# Altium project Water Tank Telemeter.PrjPcb
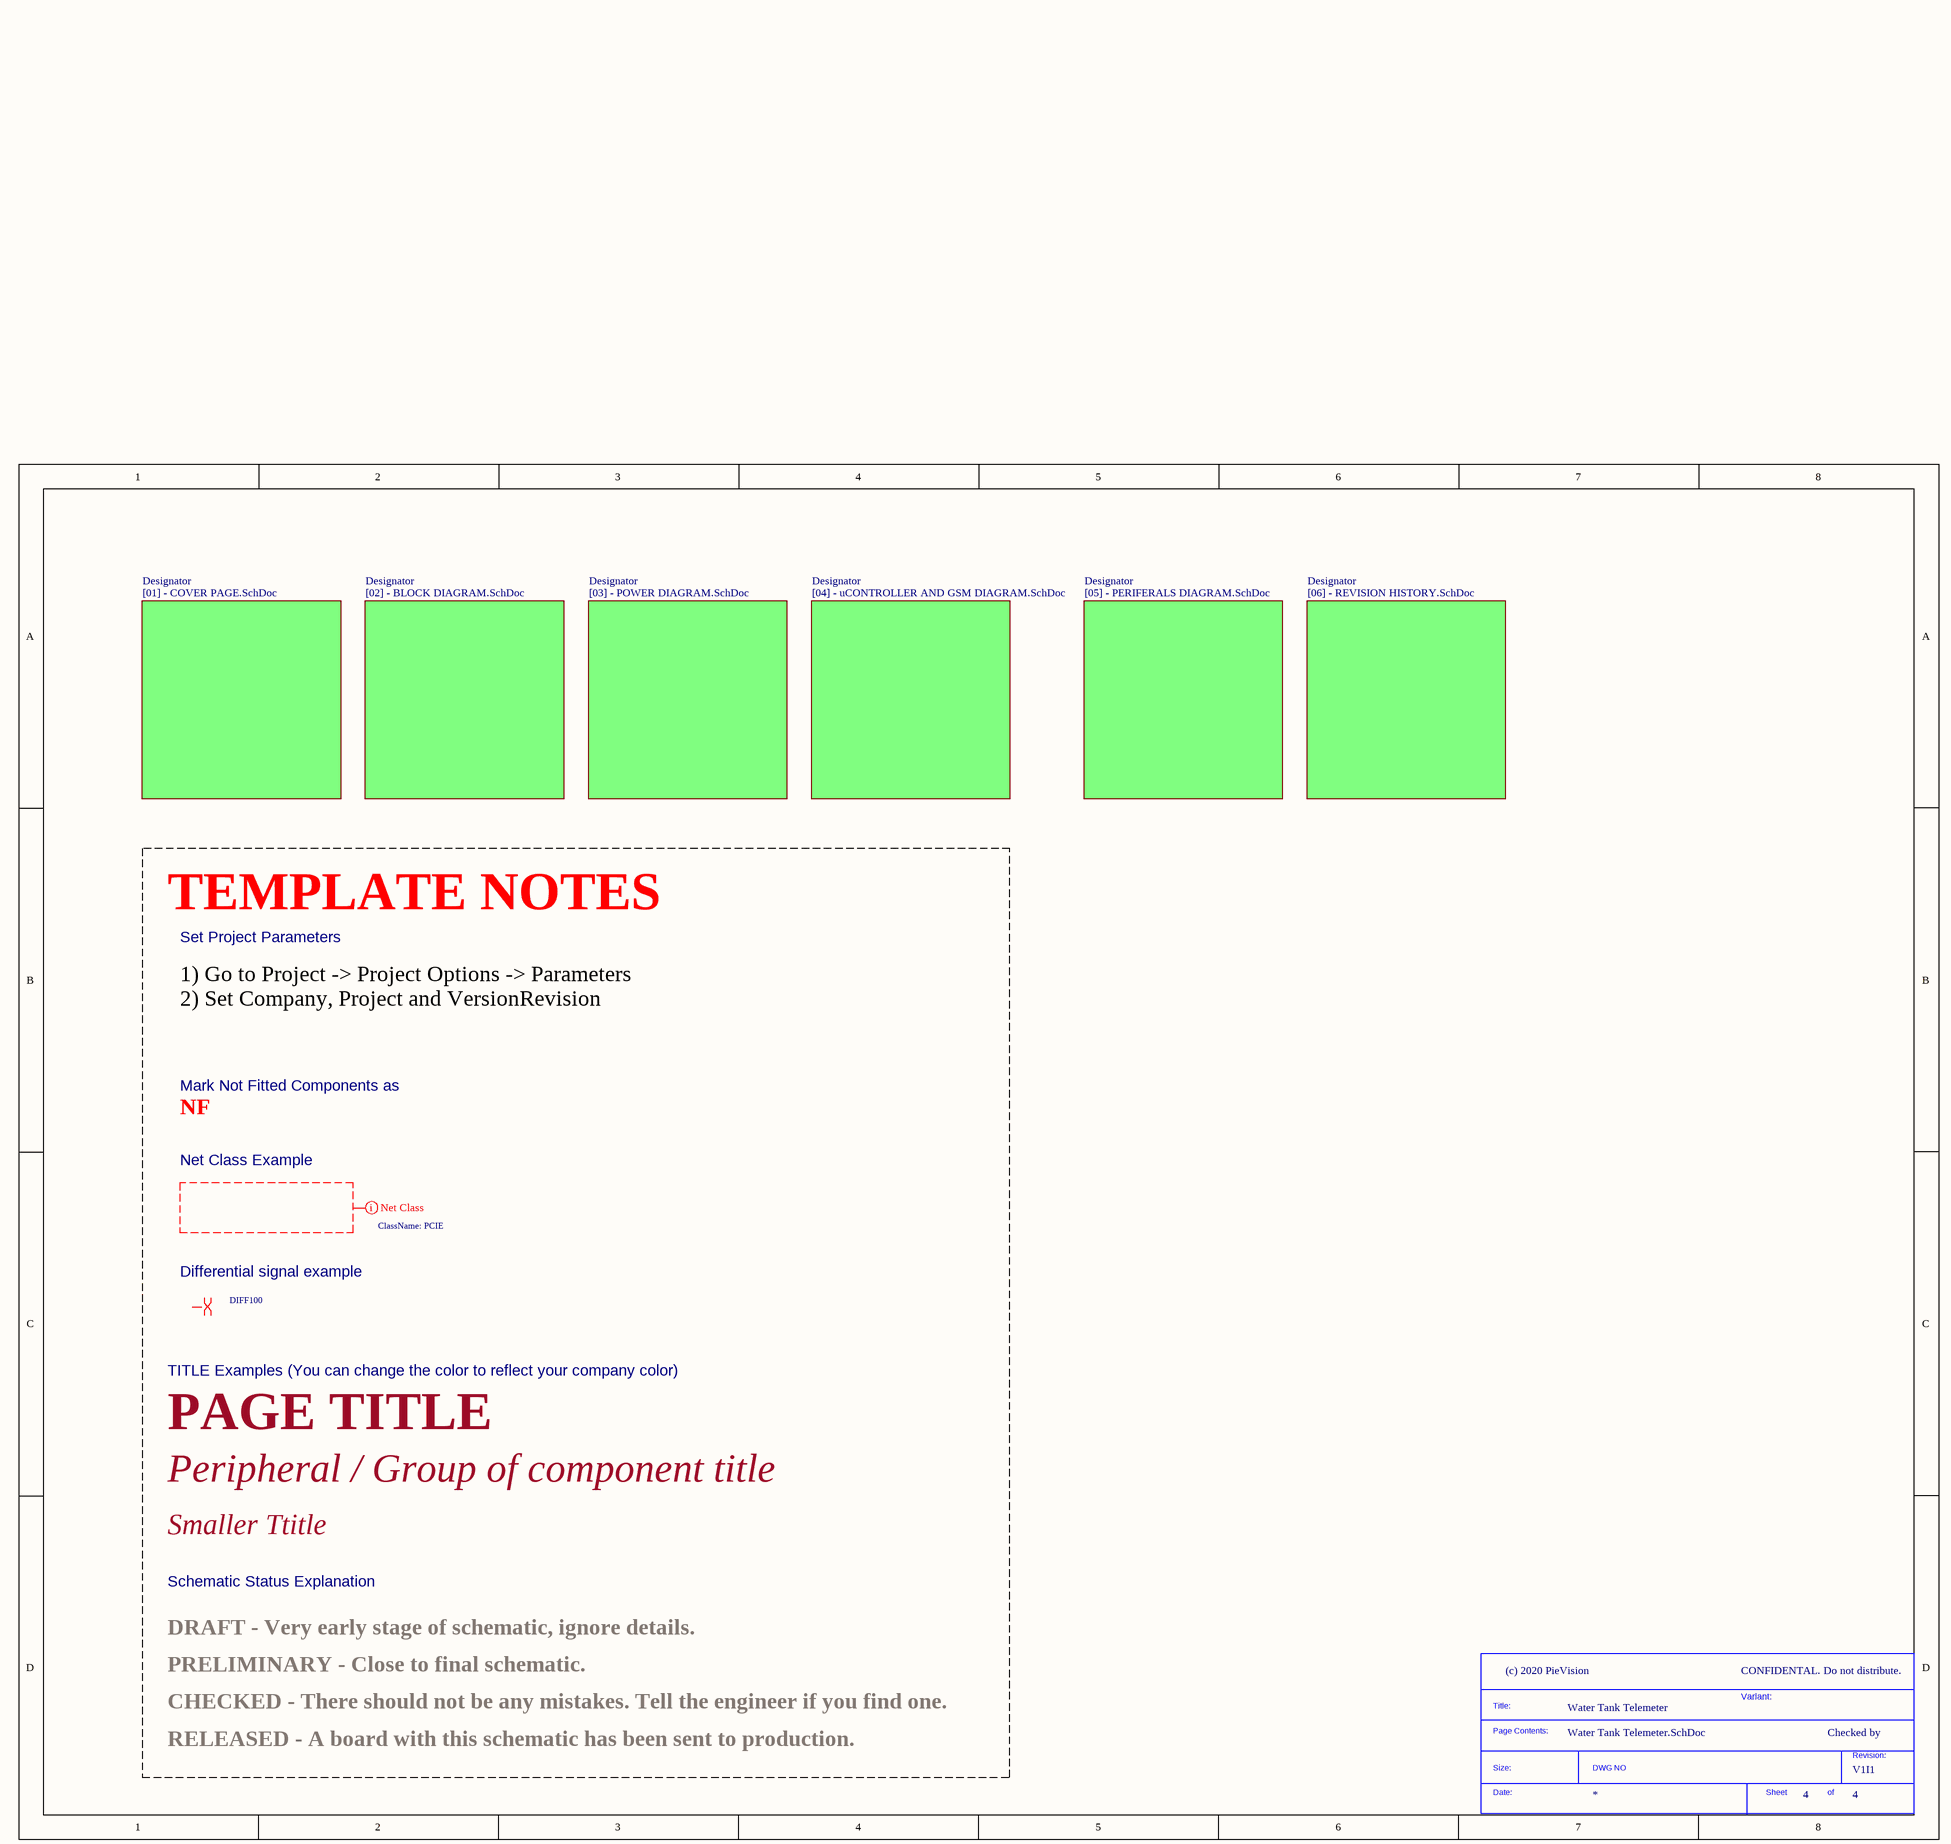
[diagram p0: Water Tank Telemeter.SchDoc]
Company: (c) 2020 PieVision; Project: Water Tank Telemeter; VersionRevision: V1I1
7 sheets, 208 parts. Net scope: flat (ports and power ports of the same name join across sheets).
Board file: Water Tank Telemeter.PcbDoc
Sheets:
  Water Tank Telemeter.SchDoc
    Designator = [01] - COVER PAGE.SchDoc
    Designator = [02] - BLOCK DIAGRAM.SchDoc
    Designator = [03] - POWER DIAGRAM.SchDoc
    Designator = [04] - uCONTROLLER AND GSM DIAGRAM.SchDoc
    Designator = [05] - PERIFERALS DIAGRAM.SchDoc
    Designator = [06] - REVISION HISTORY.SchDoc

## Sheet Water Tank Telemeter.SchDoc
size A3; CompanyName: KDS; Organization: KDS; DocumentNumber: 4; Revision: V1I1; SheetNumber: 4; SheetTotal: 4; PageSetup: Record=PageOptions|CenterHorizontal=True|CenterVertical=True|PrintScale=1.07|XCorrection=1.00|YCorrection=1.00|PrintKind=1|BorderSize=5000000|LeftOffset=0|BottomOffset=0|Orientation=2|PaperLength=1000|PaperWidth=1000|Scale=100|PaperSource=7|PrintQuality=600|MediaType=1|DitherType=10|PaperKind=A3|PrintScaleMode=1; ProjectName: KDS C6A816x Module

### Parts
(Parts that share a designator on the sheet are numbered #1, #2 ... from top to bottom, then left to right.)
*#1  SDTitleBlock  (value not drawn)  (graphical)

### Sub-sheets
Designator = [01] - COVER PAGE.SchDoc: no entries
Designator = [02] - BLOCK DIAGRAM.SchDoc: no entries
Designator = [03] - POWER DIAGRAM.SchDoc: no entries
Designator = [04] - uCONTROLLER AND GSM DIAGRAM.SchDoc: no entries
Designator = [05] - PERIFERALS DIAGRAM.SchDoc: no entries
Designator = [06] - REVISION HISTORY.SchDoc: no entries

### Layout directives
net class PCIE: (no net found under the mark)
differential pair; net class DIFF100: (no net found under the mark)

### Notes on the sheet
- TEMPLATE NOTES
- Set Project Parameters
- 1) Go to Project -> Project Options -> Parameters
  2) Set Company, Project and VersionRevision
- NF
- Mark Not Fitted Components as
- Net Class Example
- Differential signal example
- TITLE Examples (You can change the color to reflect your company color)
- PAGE TITLE
- Peripheral / Group of component title
- Smaller Ttitle
- Schematic Status Explanation
- PRELIMINARY - Close to final schematic.
- DRAFT - Very early stage of schematic, ignore details.
- CONFIDENTAL. Do not distribute.
- CHECKED - There should not be any mistakes. Tell the engineer if you find one.
- Variant:
- Checked by
- RELEASED - A board with this schematic has been sent to production.
- (in symbol SDTitleBlock) Title:; Page Contents:; Revision:; Size:; DWG NO; Date:; Sheet; of

## Sheet [01] - COVER PAGE.SchDoc
size A3; DocumentNumber: 1; SheetNumber: 1; SheetTotal: 4
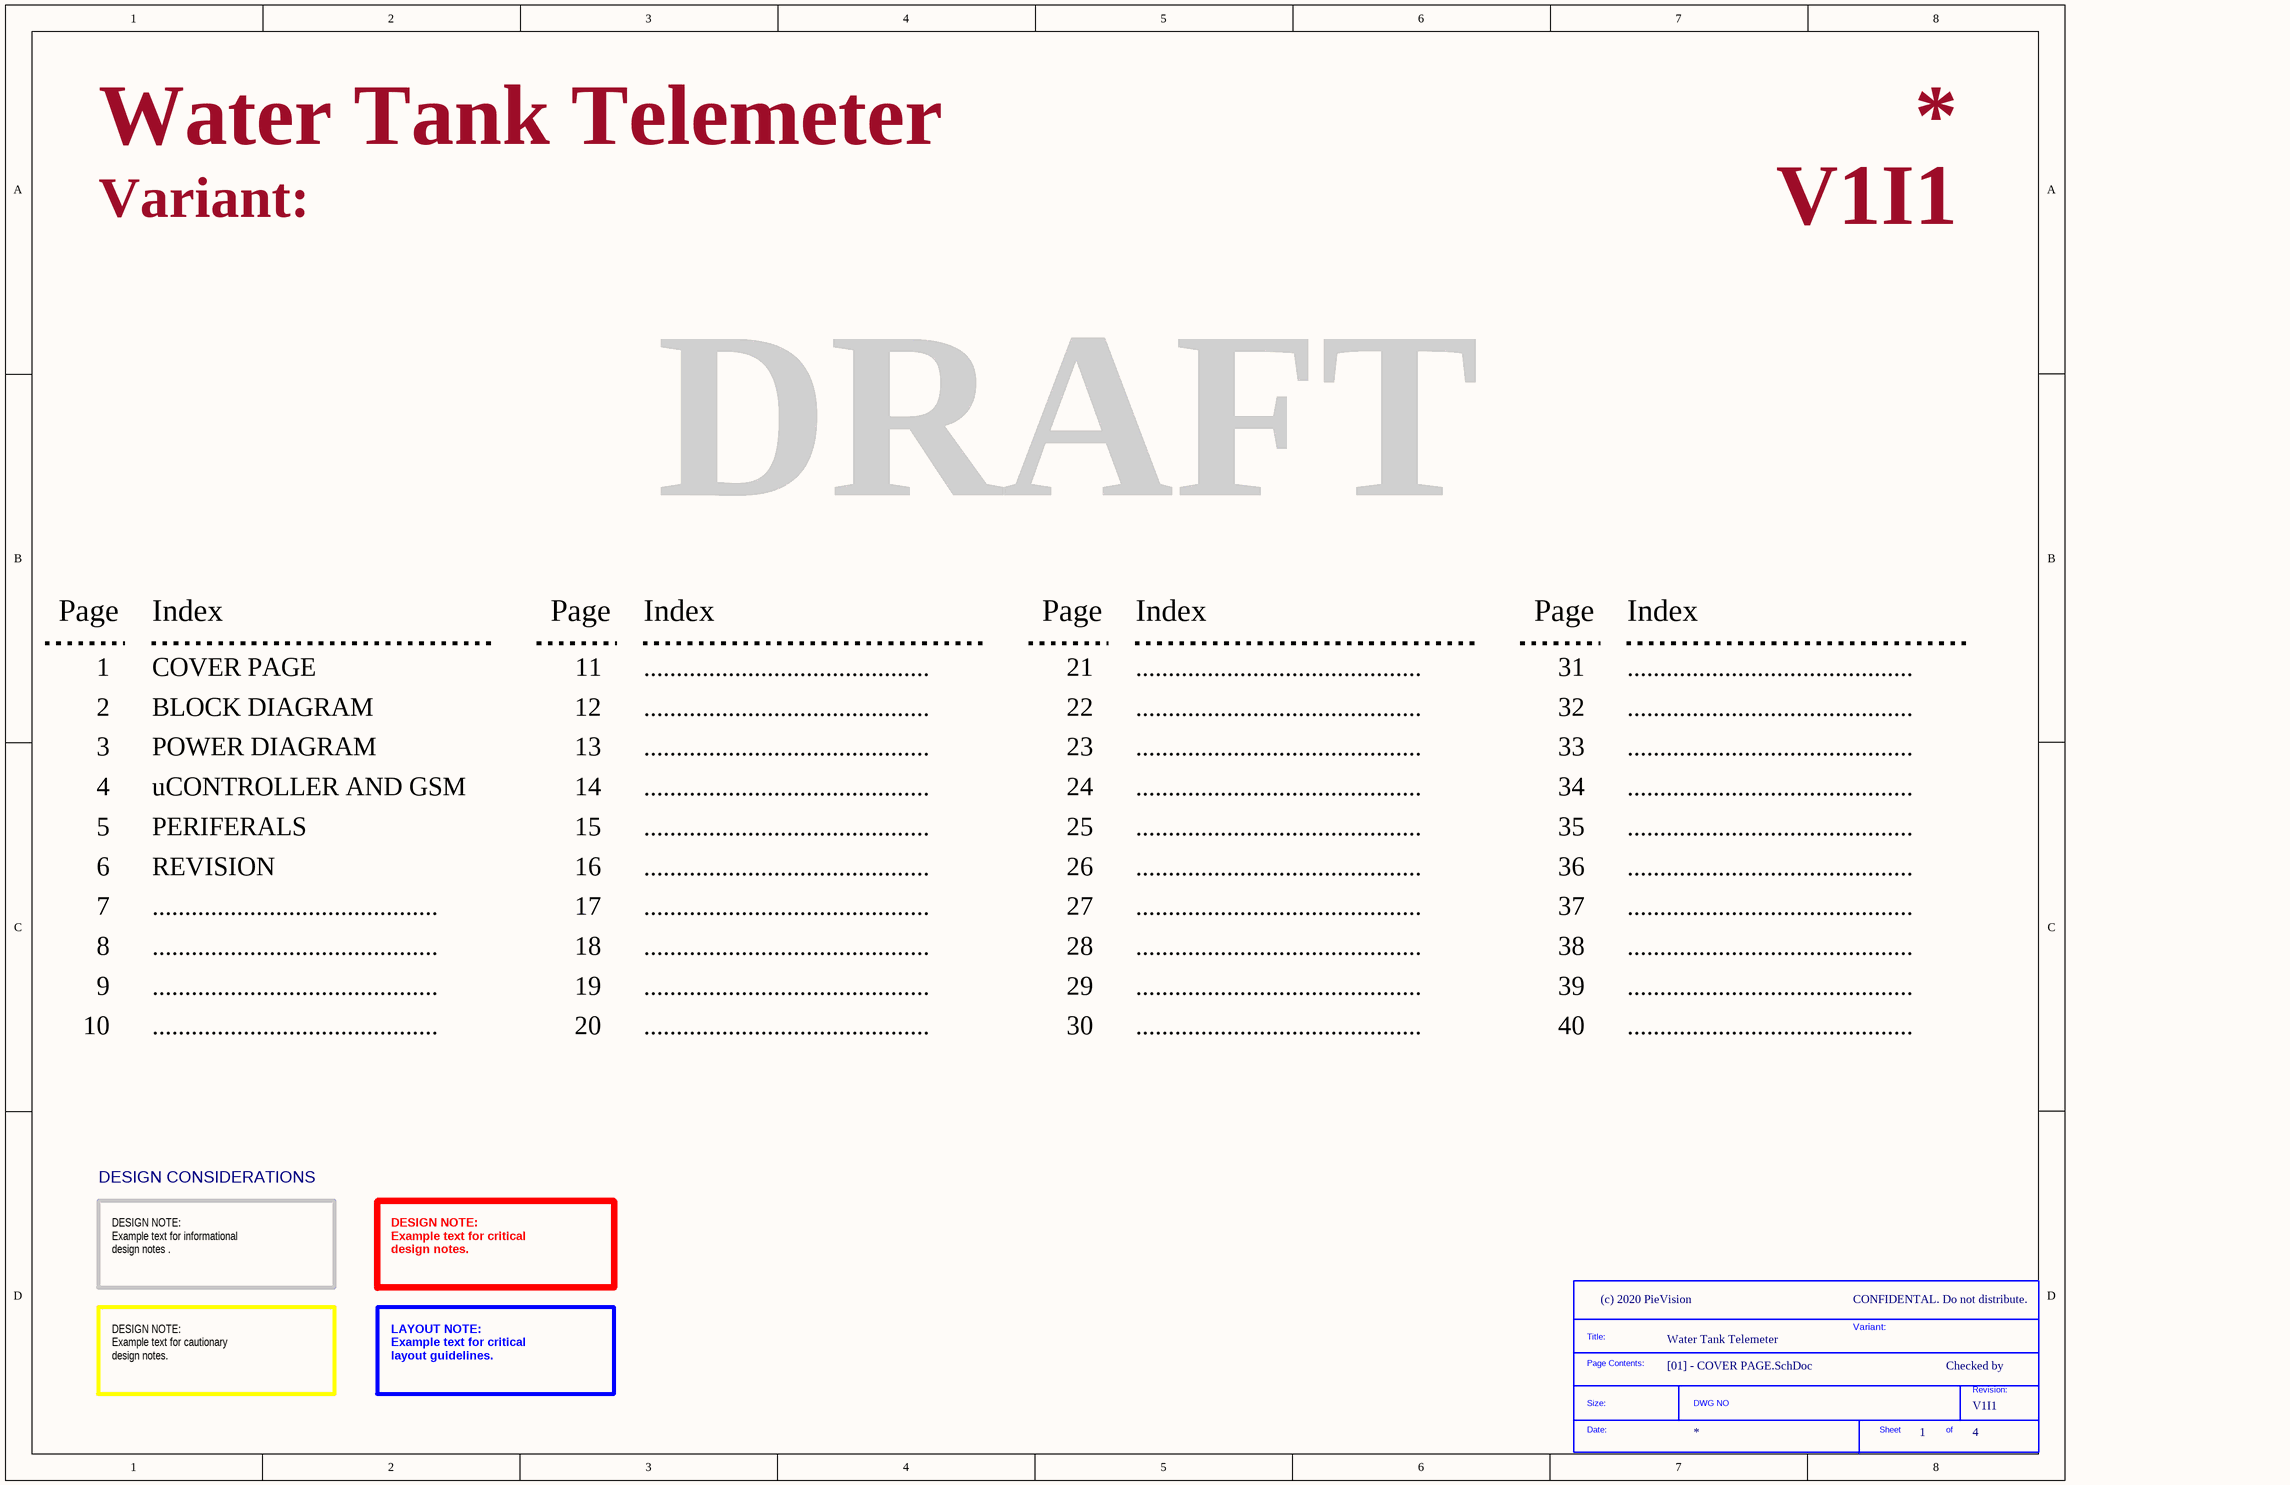
[diagram p1: [01] - COVER PAGE.SchDoc]

### Parts
(Parts that share a designator on the sheet are numbered #1, #2 ... from top to bottom, then left to right.)
*#2  SDTitleBlock  (value not drawn)  (graphical)

### Notes on the sheet
- Variant:
- DRAFT
- Page
- Index
- 1
- COVER PAGE
- 11
- ............................................
- 21
- 31
- 2
- 3
- BLOCK DIAGRAM
- POWER DIAGRAM
- 12
- 13
- 22
- 23
- 32
- 33
- 4
- 5
- uCONTROLLER AND GSM
- PERIFERALS
- 14
- 15
- 24
- 25
- 34
- 35
- 6
- REVISION
- 16
- 26
- 36
- 7
- 8
- 17
- 18
- 27
- 28
- 37
- 38
- 9
- 10
- 19
- 20
- 29
- 30
- 39
- 40
- DESIGN CONSIDERATIONS
- DESIGN NOTE:
  Example text for informational
  design notes .
- DESIGN NOTE:
  Example text for critical
  design notes.
- CONFIDENTAL. Do not distribute.
- Checked by
- DESIGN NOTE:
  Example text for cautionary
  design notes.
- LAYOUT NOTE:
  Example text for critical
  layout guidelines.
- (in symbol SDTitleBlock) Title:; Page Contents:; Revision:; Size:; DWG NO; Date:; Sheet; of

## Sheet [02] - BLOCK DIAGRAM.SchDoc
size A3; DocumentNumber: 2; SheetNumber: 2; SheetTotal: 4
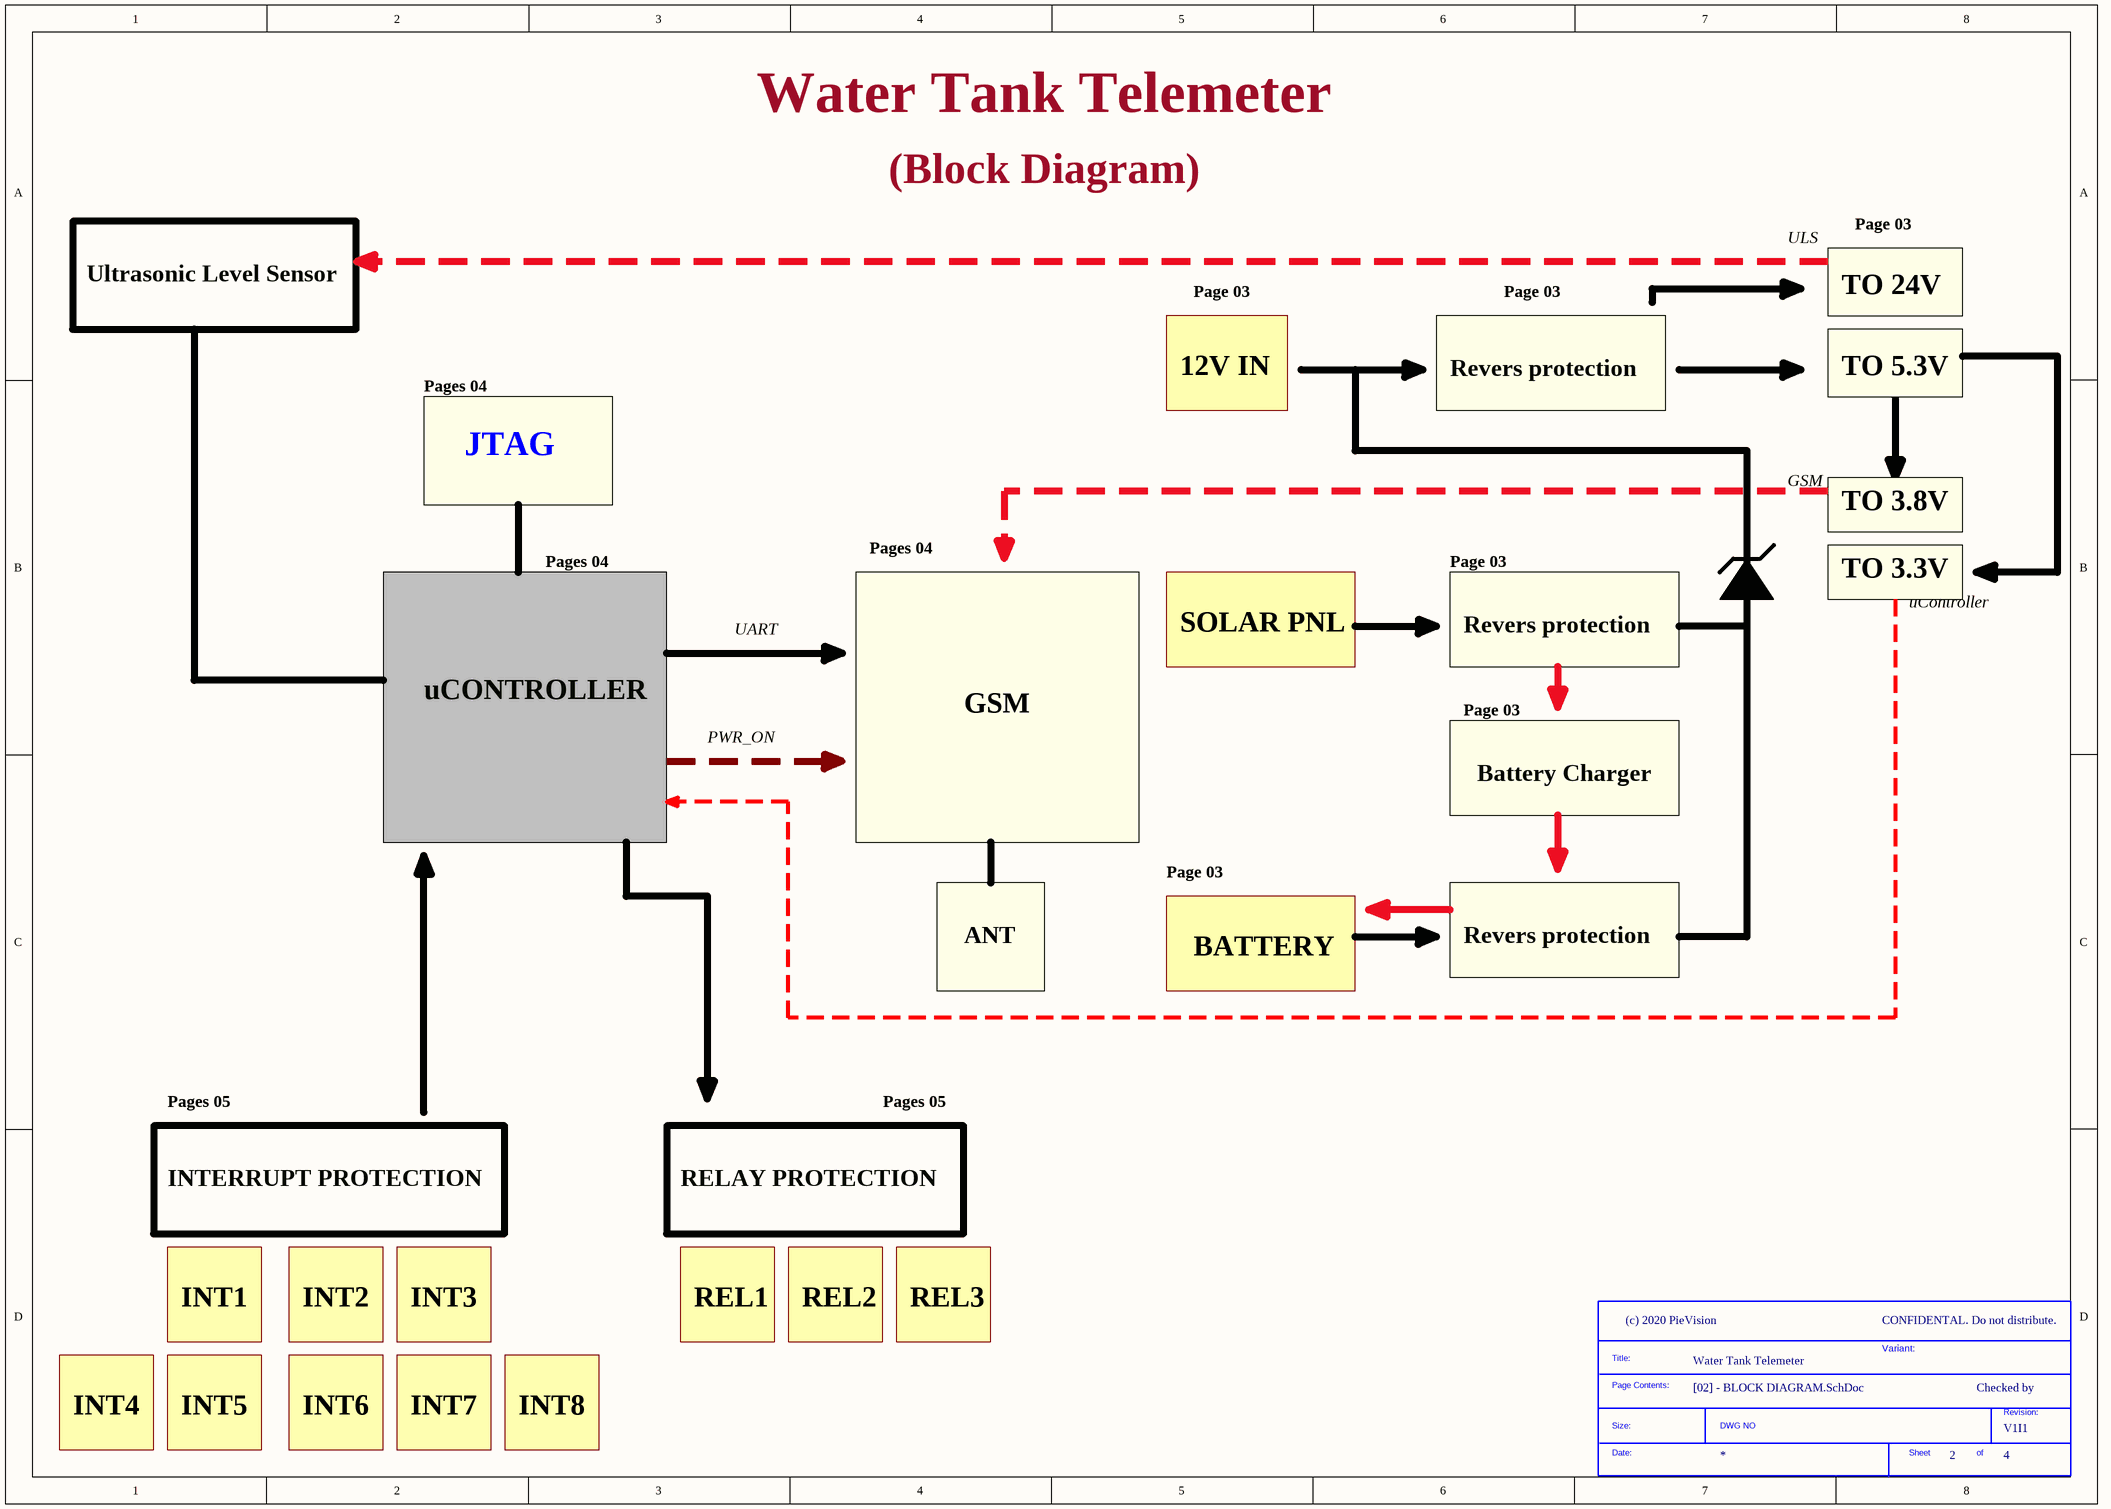
[diagram p2: [02] - BLOCK DIAGRAM.SchDoc]

### Parts
(Parts that share a designator on the sheet are numbered #1, #2 ... from top to bottom, then left to right.)
*#3  SDTitleBlock  (value not drawn)  (graphical)

### Notes on the sheet
- (Block Diagram)
- ULS
- Page 03
- Ultrasonic Level Sensor
- TO 24V
- 12V IN
- Revers protection
- TO 5.3V
- Pages 04
- JTAG
- GSM
- TO 3.8V
- TO 3.3V
- UART
- SOLAR PNL
- uController
- uCONTROLLER
- PWR_ON
- Battery Charger
- ANT
- BATTERY
- Pages 05
- INTERRUPT PROTECTION
- RELAY PROTECTION
- INT1
- INT2
- INT3
- REL1
- REL2
- REL3
- CONFIDENTAL. Do not distribute.
- Variant:
- Checked by
- INT4
- INT5
- INT6
- INT7
- INT8
- (in symbol SDTitleBlock) Title:; Page Contents:; Revision:; Size:; DWG NO; Date:; Sheet; of

## Sheet [03] - POWER DIAGRAM.SchDoc
size A3; DocumentNumber: 2; SheetNumber: 2; SheetTotal: 4; .Checked PCB: .; .Checked SCH: .
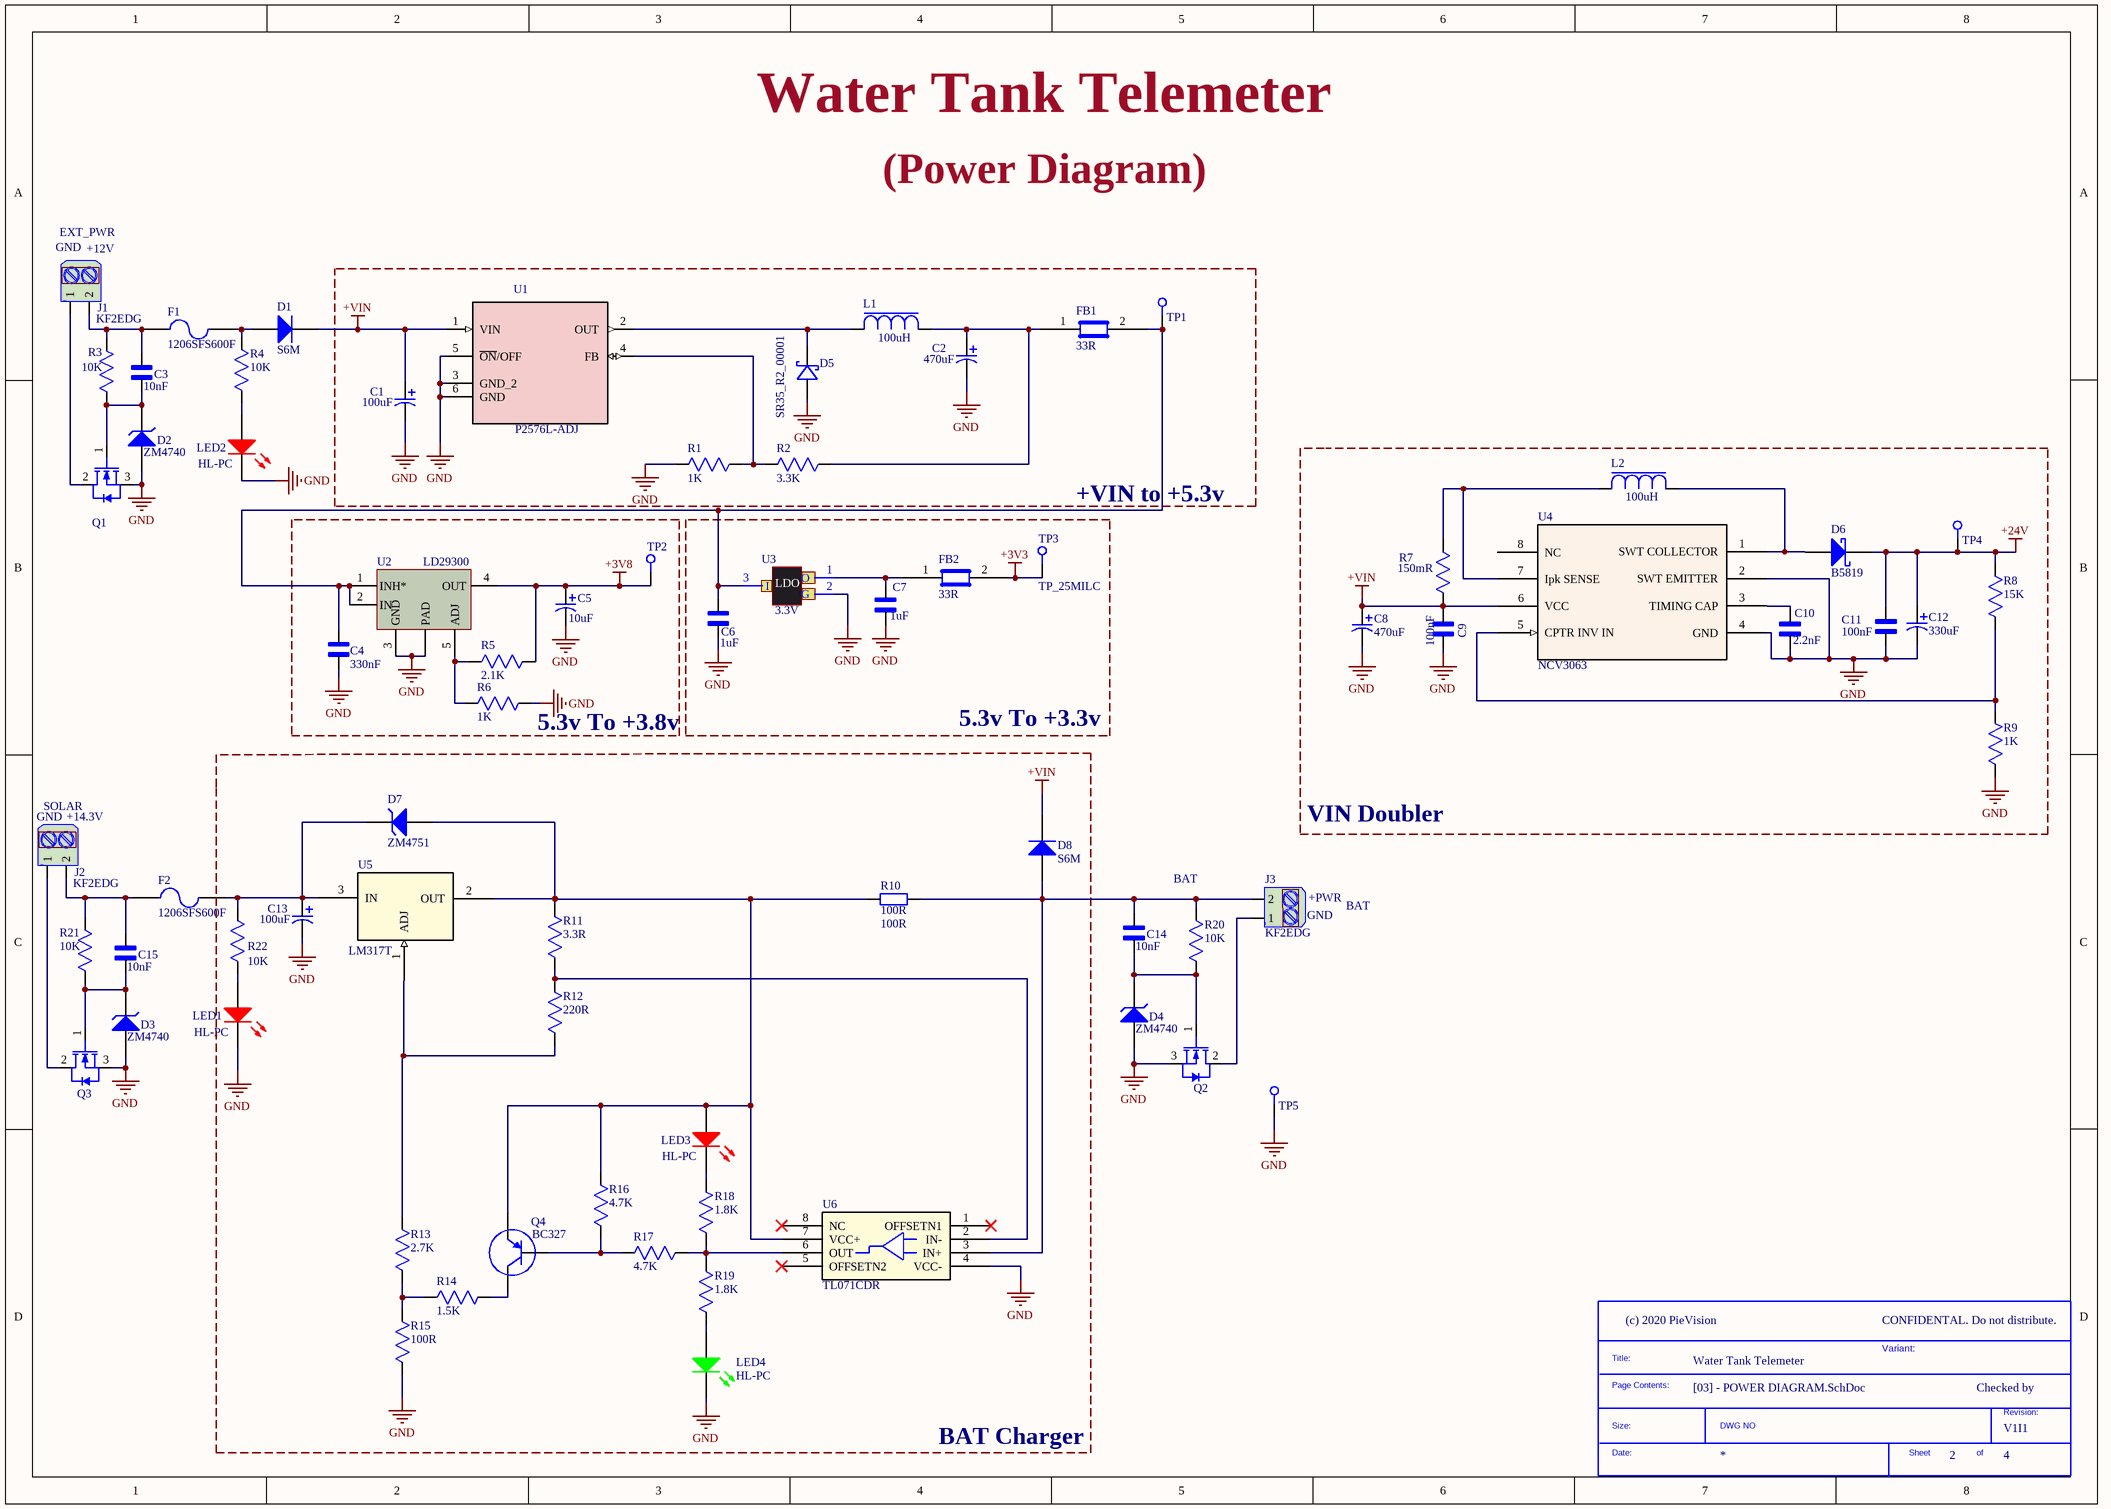
[diagram p3: [03] - POWER DIAGRAM.SchDoc]

### Parts
(Parts that share a designator on the sheet are numbered #1, #2 ... from top to bottom, then left to right.)
*#4  SDTitleBlock  (value not drawn)  (graphical)
C1  100uF  [CAP_Al_1010]
C2  470uF  [CAP_Al_1010]
C3  10nF  [CAP_0805]
C4  330nF  [CAP_0805]
C5  10uF  [CAP_AL_0553]
C6  1uF  [CAP_0805]
C7  1uF  [CAP_0805]
C8  470uF  [CAP_Al_1010]
C9  100nF  [CAP_0805]
C10  2.2nF  [CAP_0805]
C11  100nF  [CAP_0805]
C12  330uF  [CAP_AL_THT_10X20X5MM]
C13  100uF  [CAP_Al_1010]
C14  10nF  [CAP_0805]
C15  10nF  [CAP_0805]
D1  S6M  [DO-214AB]
D2  ZM4740  [MELF]
D3  ZM4740  [MELF]
D4  ZM4740  [MELF]
D5  SR35_R2_00001  [DO214AA]
D6  B5819  [SOD123]
D7  ZM4751  [MELF]
D8  S6M  [DO-214AB]
F1  1206SFS600F  [FUS_1206]
F2  1206SFS600F  [FUS_1206]
FB1  33R  [FB_0603]
FB2  33R  [FB_0603]
J1  KF2EDG  [TERM_BLK_2P_F]
J2  KF2EDG  [TERM_BLK_2P_F]
J3  KF2EDG  [TERM_BLK_2P_F]
L1  100uH  [IND_1212]
L2  100uH  [IND_1212]
LED1  HL-PC  [LED_RED_1206]
LED2  HL-PC  [LED_RED_1206]
LED3  HL-PC  [LED_RED_1206]
LED4  HL-PC  [LED_GREEN_1206]
Q1  NDT3055L  [SOT223]  (value not drawn)
Q2  NDT3055L  [SOT223]  (value not drawn)
Q3  NDT3055L  [SOT223]  (value not drawn)
Q4  BC327  [TO-92]
R1  1K  [RES_0805]
R2  3.3K  [RES_0805]
R3  10K  [RES_0805]
R4  10K  [RES_0805]
R5  2.1K  [RES_0805]
R6  1K  [RES_0805]
R7  150mR  [RES_2512]
R8  15K  [RES_0805]
R9  1K  [RES_1206]
R10  100R  [RES_AXL_22X9]
R11  3.3R  [RES_0805]
R12  220R  [RES_0805]
R13  2.7K  [RES_0805]
R14  1.5K  [RES_0805]
R15  100R  [RES_0805]
R16  4.7K  [RES_0805]
R17  4.7K  [RES_0805]
R18  1.8K  [RES_0805]
R19  1.8K  [RES_0805]
R20  10K  [RES_0805]
R21  10K  [RES_0805]
R22  10K  [RES_0805]
TP1  TP_25MILC  [TP]  (value not drawn)  (no BOM)
TP2  TP_25MILC  [TP]  (value not drawn)  (no BOM)
TP3  TP_25MILC  [TP]  (no BOM)
TP4  TP_25MILC  [TP]  (value not drawn)  (no BOM)
TP5  TP_25MILC  [TP]  (value not drawn)  (no BOM)
U1  P2576L-ADJ  [TO170P1435X465-6N]
U2  LD29300  [D2PAK/A]
U3  3.3V  [SOT-23]
U4  NCV3063  [SOIC-8]
U5  LM317T  [TO-220AB]
U6  TL071CDR  [SOIC-8]

### Blocks framed on the sheet
VIN Doubler: C8-C12 D6 L2 R7-R9 TP4 U4
5.3v To +3.8v: C4 C5 R5 R6 TP2 U2
BAT Charger: C13 D7 D8 LED1 LED3 LED4 Q4 R10-R19 R22 U5 U6

### Nets
+3V3: FB2.2 TP3.1
+3V8: C5.1 R5.1 TP2.1 U2.4(OUT)
+24V: C11.1 C12.1 D6.1(K) R8.1 TP4.1
+VIN: C1.1 C8.1 C9.1 D1.1(K) D8.1(K) R7.1 U1.1(VIN) U4.6(VCC)
GND: C1.2 C2.2 C4.1 C5.2 C6.1 C7.1 C8.2 C9.2 C10.2 C11.2 C12.2 C13.2 D2.2(A) D3.2(A) D4.2(A) D5.2 LED1.1(K) LED2.1(K) LED4.1(K) Q1.3(S) Q2.3(S) Q3.3(S) R1.2 R6.2 R9.1 R15.2 TP5.1 U1.3(GND_2) U1.5(~{ON}/OFF) U1.6(GND) U2.3(GND) U2.PAD U3.2(G) U4.2(SWT_EMITTER) U4.4(GND) U6.4(VCC-)
NetC2_1: C2.1 FB1.1 L1.1 R2.1
NetC3_1: C3.1 D2.1(K) Q1.1(G) R3.2
NetC3_2: C3.2 F1.2 J1.2 R3.1
NetC4_2: C4.2 C6.2 FB1.2 TP1.1 U2.1(INH*) U2.2(IN) U3.3(I)
NetC7_2: C7.2 FB2.1 U3.1(O)
NetC10_1: C10.1 U4.3(TIMING_CAP)
NetC13_1: C13.1 D7.1(K) F2.1 R22.1 U5.3(IN)
NetC14_1: C14.1 D4.1(K) Q2.1(G) R20.2
NetC14_2: C14.2 D8.2(A) J3.2 R10.2 R20.1 U6.3(IN+)
NetC15_1: C15.1 D3.1(K) Q3.1(G) R21.2
NetC15_2: C15.2 F2.2 J2.2 R21.1
NetD1_2: D1.2(A) F1.1 R4.1
NetD5_1: D5.1 L1.2 U1.2(OUT)
NetD6_2: D6.2(A) L2.1 U4.1(SWT_COLLECTOR)
NetD7_2: D7.2(A) LED3.2(A) Q4.3(E) R10.1 R11.1 R16.1 U5.2(OUT) U6.7(VCC+)
NetJ1_1: J1.1 Q1.2(D)
NetJ2_1: J2.1 Q3.2(D)
NetJ3_1: J3.1 Q2.2(D)
NetL2_2: L2.2 R7.2 U4.7(Ipk_SENSE)
NetLED1_2: LED1.2(A) R22.2
NetLED2_2: LED2.2(A) R4.2
NetLED3_1: LED3.1(K) R18.1
NetLED4_2: LED4.2(A) R19.2
NetQ4_1: Q4.1(C) R14.1
NetQ4_2: Q4.2(B) R16.2 R17.2
NetR1_1: R1.1 R2.2 U1.4(FB)
NetR5_2: R5.2 R6.1 U2.5(ADJ)
NetR8_2: R8.2 R9.2 U4.5(CPTR_INV_IN)
NetR11_2: R11.2 R12.1 U6.2(IN-)
NetR12_2: R12.2 R13.1 U5.1(ADJ)
NetR13_2: R13.2 R14.2 R15.1
NetR17_1: R17.1 R18.2 R19.1 U6.6(OUT)

Not connected (* = marked no-connect by the designer): U4 8(NC); U6 1(OFFSETN1)* 5(OFFSETN2)* 8(NC)*

### Notes on the sheet
- EXT_PWR
- (Power Diagram)
- (near J1) GND
- (near J1) +12V
- +VIN to +5.3v
- 5.3v To +3.3v
- (near J2) GND
- (near J2) SOLAR
- (near J2) +14.3V
- (near R20) BAT
- (near J3) GND
- (near J3) +PWR
- BAT
- CONFIDENTAL. Do not distribute.
- Variant:
- Checked by
- (in symbol MCP1700) LDO
- (in symbol SDTitleBlock) Title:; Page Contents:; Revision:; Size:; DWG NO; Date:; Sheet; of

### Library data of the parts
C1 C13 = CAP_AL_1010: =Product Description; Product Name: BXJ63VC100MJ10TP; Product Description: CAP.EL.100uF 63V 10x10 105C 5000Hrs SMD; .Checked PCB: CHK; Value: 100uF; Dimensions (mm) DxL: 10.00x10.00; .Checked SCH: CHK
C2 = CAP_AL_1010: =Product Description; Product Name: BDS25VC470MJ10TP; Product Description: CAP.EL.470uF 25V 10x10 105C 2000Hrs SMD ±20%; .Checked PCB: CHK; Value: 470uF; Dimensions (mm) DxL: 10.00x10.00; .Checked SCH: CHK
C3 C14 = CAP_0805: Product Name: CL21C103JBFNNNE; Product Description: MLCC (2012) 0805 10nF 50VDC ±5% C0G (NP0); .Checked PCB: CHK; Package: 0805; Value: 10nF; .Checked SCH: CHK
C4 = CAP_0805: =Product Description; Manufacturer: SAMSUNG; Product Name: CL21B334KOCNNNC; Product Description: MLCC (2012) 0805 330nF 16VDC ±10% X7R; .Checked PCB: CHK; Value: 330nF; Package / Case: 0805; .Checked SCH: CHK
C5 = CAP_AL_0553: =Product Description; Manufacturer: SAMWHA; Product Name: SC1V106M05005VR; Product Description: CAP.EL.10uF 35V 5x5.3 85C SMD SAMWHA; .Checked PCB: CHK; Value: 10uF; .Checked SCH: CHK
C6 C7 = CAP_0805: Product Name: CL21F105ZBFNNNE; Product Description: MLCC (2012) 0805 1uF 50VDC -20% +80% Y5V; .Checked PCB: CHK; Package: 0805; Value: 1uF; .Checked SCH: CHK
C8 = CAP_AL_1010: =Product Description; Product Name: BDS25VC470MJ10TP; Product Description: CAP.EL.470uF 25V 10x10 105C 2000Hrs SMD; .Checked PCB: CHK; Value: 470uF; Dimensions (mm) DxL: 10.00x10.00; .Checked SCH: CHK
C9 C11 = CAP_0805: Product Name: CL21B104JBCNNNC; Product Description: MLCC (2012) 0805 100nF 50VDC ±5% X7R; .Checked PCB: CHK; Package: 0805; Value: 100nF; .Checked SCH: CHK
C10 = CAP_0805: =Product Description; Product Name: CL21B222JBANNNC; Product Description: MLCC (2012) 0805 2.2nF 50VDC ±5% X7R; .Checked PCB: CHK; Package: 0805; Value: 2.2nF; .Checked SCH: CHK
C12 = CAP_AL_THT_10X12X5MM: =Product Description; Manufacturer: SAMWHA; Product Name: LQ1H337M10020PA; Product Description: CAP.EL.330uF 50V 10x20 105C 10000H TB; .Checked PCB: CHK; Value: 330uF; .Checked SCH: CHK
C15 = CAP_0805: Product Name: CL21C103JBFNNNE; Product Description: MLCC (2012) 0805 10nF 50VDC ±5% C0G (NP0); .Checked PCB: .; Package: 0805; Value: 10nF; .Checked SCH: .
D1 D8 = DID_DO214: =Product Description; Product Name: S6M-DC; Product Description: DIODE 6A 1000V SMT DO214AB (SMC); .Checked PCB: CHK; Package: DO214AB; Value: S6M; .Checked SCH: CHK
D2 D3 = DID_ZEN_MELF: =Product Description; Product Name: ZM4740A-HT; Product Description: DIODE ZENER 1W 10V ±5% LL-41 (MELF) SMT; .Checked PCB: .; Package: MELF; Value: ZM4740; .Checked SCH: .
D4 = DID_ZEN_MELF: =Product Description; Product Name: ZM4740A-HT; Product Description: DIODE ZENER 1W 10V ±5% LL-41 (MELF) SMT; .Checked PCB: CHK; Package: MELF; Value: ZM4740; .Checked SCH: CHK
D5 = D_SCK_DO214AA: Product Description; Manufacturer: PANJIT; Product Description: DIODE SCHOTTKY 3A 50V DO214AA SMB PANJIT; .Checked PCB: CHK; Product Name: SR35_R2_00001; Package / Case: DO214AA; .Checked SCH: CHK
D6 = DID_SCHK_SOD123: =Product Description; Product Name: B5819W; Product Description: DIODE SCHOTTKY 1A 40V SOD123; .Checked PCB: CHK; Package: SOD123; Value: B5819; .Checked SCH: CHK
D7 = DID_ZEN_MELF: =Product Description; Product Name: ZM4751A-HT; Product Description: DIODE ZENER 1W 30V ±5% LL-41 (MELF) SMT; .Checked PCB: .; Package: MELF; Value: ZM4751; .Checked SCH: .
F1 = FUZ_SMD_1206: =Product Description; Product Name: 1206SFS600F/24-2; Product Description: FUSE BOARD MOUNT 6A 24VDC 1206; .Checked PCB: CHK; Package: 1206; Value: 1206SFS600F; .Checked SCH: CHK
F2 = FUZ_SMD_1206: =Product Description; Product Name: 1206SFS600F/24-2; Product Description: FUSE BOARD MOUNT 6A 24VDC 1206; .Checked PCB: .; Package: 1206; Value: 1206SFS600F; .Checked SCH: .
FB1 FB2 = FB_0603: =Product Description; Manufacturer: MURATA; Product Name: BLM18PG330SN1D; Product Description: FERRITE BEAD 0603 33R 3A MURATA; .Checked PCB: CHK; Value: 33R; Package / Case: 0603; .Checked SCH: CHK
J1-J3 = TERM_BLK_2POS_F: =Product Description; Product Name: KF2EDG-5.08-2P-14; Product Description: TERM.BLK.5.08MM 2P FEMALE GREEN; ComponentLink1URL: https://www.ozdisan.com/konnektor-ve-baglanti-elemanlari/klemensler/gecmeli-klemensler/KF2EDG-5-08-2P-14; ComponentLink1Description: TERM.BLK.5.08MM 2P FEMALE GREEN; Value: KF2EDG
L1 L2 = IND_1212: =Product Description; Product Name: SRI1207-101M; Product Description: INDUCTOR POWER 100UH 12X12X8MM SMD; .Checked PCB: CHK; Inductance: 100uH; Dimensions (mm) LxWxH: 12.00x12.00x8.00; .Checked SCH: CHK; Value: 100uH
LED1 LED3 = LED_RED_1206: =Product Description; Manufacturer: HONGLITRONIC; Product Description: LED SMD 1206 RED WATER CLEAR 90-120 mcd 140C; Product Name: HL-PC-3216S9AC; Color: RED; .Checked PCB: CHK; Value: HL-PC; .Checked SCH: CHK
LED2 = LED_RED_1206: =Product Description; Manufacturer: HONGLITRONIC; Product Description: LED SMD 1206 RED WATER CLEAR 90-120 mcd 140C; Product Name: HL-PC-3216S9AC; Color: RED; .Checked PCB: .; Value: HL-PC; .Checked SCH: .
LED4 = LED_GREEN_1206: =Product Description; Manufacturer: HONGLITRONIC; Product Description: LED SMD 1206 GREEN WATER CLEAR 600-800mcd; Product Name: HL-PC-3216U51GC; Color: GREEN; .Checked PCB: CHK; Value: HL-PC; .Checked SCH: CHK
Q1-Q3 = MOSFET_N_SOT223: =Product Description; Manufacturer: ONS; Product Description: MOSFET DIS.4A 60V N-CH SOT223 ENHANCEMENT SMT; .Checked PCB: CHK; Product Name: NDT3055L; Package / Case: SOT223; Value: NDT3055L; .Checked SCH: CHK
Q4 = BJT_PNP_THT_CBE: =Product Description; Product Name: BC327-40ZL1G; Product Description: TRANSISTOR DIS.500mA 50V PNP TO92 AMP THT	TRANSISTOR DIS.500mA 50V PNP TO92 AMP THT; Package: TO-92; Value: BC327
R1 = RES_0805: =Product Description; Product Name: 0805S8F1001T5E; Product Description: RES.(2012) 0805 1K Ohms 1% 1/8W-S 100PPM; Tolerance: ±1%; Watt: 1/8W-S; .Checked PCB: CHK; Package / Case: 0805; Value: 1K; .Checked SCH: CHK
R2 = RES_0805: =Product Description; Product Name: 0805S8F3301T5E; Product Description: RES.(2012) 0805 3.3K Ohms 1% 1/8W-S 100PPM; Tolerance: ±1%; Watt: 1/8W-S; .Checked PCB: CHK; Package / Case: 0805; Value: 3.3K; .Checked SCH: CHK
R3 R22 = RES_0805: =Product Description; Product Name: 0805S8F1002T5E; Product Description: RES.(2012) 0805 10K Ohms 1% 1/8W-S 100PPM; Tolerance: ±1%; Watt: 1/8W-S; .Checked PCB: CHK; Package / Case: 0805; Value: 10K; .Checked SCH: CHK
R4 R20 R21 = RES_0805: =Product Description; Product Name: 0805S8F1002T5E; Product Description: RES.(2012) 0805 10K Ohms 1% 1/8W-S 100PPM; Tolerance: ±1%; Watt: 1/8W-S; .Checked PCB: .; Package / Case: 0805; Value: 10K; .Checked SCH: .
R5 = RES_0805: =Product Description; Product Name: 0805S8F2101T5E; Product Description: RES.(2012) 0805 2.1K Ohms 1% 1/8W-S 100PPM; Tolerance: ±1%; Watt: 1/8W-S; .Checked PCB: CHK; Package / Case: 0805; Value: 2.1K; .Checked SCH: CHK
R6 = RES_0805: =Product Description; Product Name: 0805S8J0102T5E; Product Description: RES.(2012) 0805 1K Ohms 5% 1/8W-S 100PPM; Tolerance: ±5%; Watt: 1/8W-S; .Checked PCB: CHK; Package / Case: 0805; Value: 1K; .Checked SCH: CHK
R7 = RES_2512: =Product Description; Product Name: HP122WF150LT4E; Product Description: RES.(6432) 2512 150m Ohms 1% 2W 200PPM; .Checked PCB: .; Package: 2512; Value: 150mR; .Checked SCH: .
R8 = RES_0805: =Product Description; Product Name: 0805S8J0153T5E; Product Description: RES.(2012) 0805 15K Ohms 5% 1/8W-S 100PPM; .Checked PCB: .; Package: 0805; Value: 15K; .Checked SCH: .
R9 = RES_1206: =Product Description; Product Name: 1206S4F1001T5E; Product Description: RES.(3216) 1206 1K Ohms 1% 1/4W-S 100PPM; Tolerance: ±1%; Watt: 1/4W-S; Package / Case: 1206 (3216 Metric); Value: 1K; .Checked PCB: 1206S4F1001T5E; .Checked SCH: 1206S4F1001T5E
R10 = RES_AXL_20X9: =Product Description; Product Name: PRW05WJP101B00; Product Description: RES.CEMENT 5W 100 Ohms 5% THT; .Checked PCB: CHK; Package: AXIAL; Value: 100R; .Checked SCH: CHK
R11 = RES_0805: =Product Description; Product Name: RC2012F3R3CS; Product Description: RES.(2012) 0805 3.3 Ohms 1% 1/8W +300PPM~-200PPM; Tolerance: ±1%; Watt: 1/8W; .Checked PCB: CHK; Package / Case: 0805; Value: 3.3R; .Checked SCH: CHK
R12 = RES_0805: =Product Description; Product Name: ERJ-P06D2200V; Product Description: RES.(2012) 0805 220 Ohms 0.5% 1/2W 100PPM; Tolerance: ±0.5%; Watt: 1/2W; .Checked PCB: CHK; Package / Case: 0805; Value: 220R; .Checked SCH: CHK
R13 = RES_0805: =Product Description; Product Name: 0805S8F2701T5E; Product Description: RES.(2012) 0805 2.7K Ohms 1% 1/8W-S 100PPM; Tolerance: ±1%; Watt: 1/8W-S; .Checked PCB: CHK; Package / Case: 0805; Value: 2.7K; .Checked SCH: CHK
R14 = RES_0805: =Product Description; Product Name: 0805S8F1501T5E; Product Description: RES.(2012) 0805 1.5K Ohms 1% 1/8W-S 100PPM; Tolerance: ±1%; Watt: 1/8W-S; .Checked PCB: CHK; Package / Case: 0805; Value: 1.5K; .Checked SCH: CHK
R15 = RES_0805: =Product Description; Product Name: 0805S8F1000T5E; Product Description: RES.(2012) 0805 100 Ohms 1% 1/8W-S 200PPM; Tolerance: ±1%; Watt: 1/8W-S; .Checked PCB: CHK; Package / Case: 0805; Value: 100R; .Checked SCH: CHK
R16 R17 = RES_0805: =Product Description; Product Name: 0805S8J0472T5E; Product Description: RES.(2012) 0805 4.7K Ohms 5% 1/8W-S 100PPM; Tolerance: ±5%; Watt: 1/8W-S; .Checked PCB: CHK; Package / Case: 0805; Value: 4.7K; .Checked SCH: CHK
R18 R19 = RES_0805: =Product Description; Product Name: 0805S8J0182T5E; Product Description: RES.(2012) 0805 1.8K Ohms 5% 1/8W-S 100PPM; Tolerance: ±5%; Watt: 1/8W-S; .Checked PCB: CHK; Package / Case: 0805; Value: 1.8K; .Checked SCH: CHK
TP1 TP4 TP5 = TP_25MILC: Test Point 25mil; .Checked PCB: CHK; .Checked SCH: CHK
TP2 = TP_25MILC: Test Point 25mil; .Checked PCB: .; .Checked SCH: .
TP3 = TP_25MILC: Test Point 25mil
U1 = P2576L-AD-TQ5-R: IC-2576 V.REG.3A ADJ SIMPL.STEP-DOWN SMD TO-263; Manufacturer: UTC; .Checked PCB: CHK; Product Name: P2576L-AD-TQ5-R; Product Description: IC-2576 V.REG.3A ADJ SIMPL.STEP-DOWN SMD TO-263; Package / Case: TO263-5 (D2PAK-5); .Checked SCH: CHK
U2 = LD29300: =Product Description; Manufacturer: STM; Product Name: LD29300P2MTR; Product Description: IC-29300 REG. LDO. ADJ 3A P2PAK/A; .Checked SCH: CHK; Package / Case: P2PAK/A; .Checked PCB: CHK; Value: LD29300
U3 = MCP1700: =Product Description; Product Name: MCP1700T-3302E/TT; Product Description: IC-1700 REG LDO 3.3V 0.25A SOT23-3; .Checked SCH: CHK; Package / Case: SOT23-3; Value: 3.3V; .Checked PCB: CHK
U4 = NCV3063DR2G: =Product Description; Product Description: IC-3063 INV. SWITCHING REGULATORS SOIC8 SMD ONS; .Checked PCB: CHK; Product Name: NCV3063DR2G; Package: SOIC8; Value: NCV3063; .Checked SCH: CHK
U5 = LM317T: =Product Description; Product Name: LM317T-DG; Product Description: IC-317 V.REG/STABILIZER 1.5A TO220 DOUBLE GAUG ST; Value: LM317T; Package: TO220-3
U6 = TL071CDR: =Product Description; Manufacturer: SOIC8; Product Description: IC-071 OPAMP JFET 3MHZ SOIC8; Value: TL071CDR; Product Name: TL071CDR; Package: SOIC8

## Sheet [04] - uCONTROLLER AND GSM DIAGRAM.SchDoc
size A3; DocumentNumber: 2; SheetNumber: 2; SheetTotal: 4; .Checked PCB: .; .Checked SCH: .
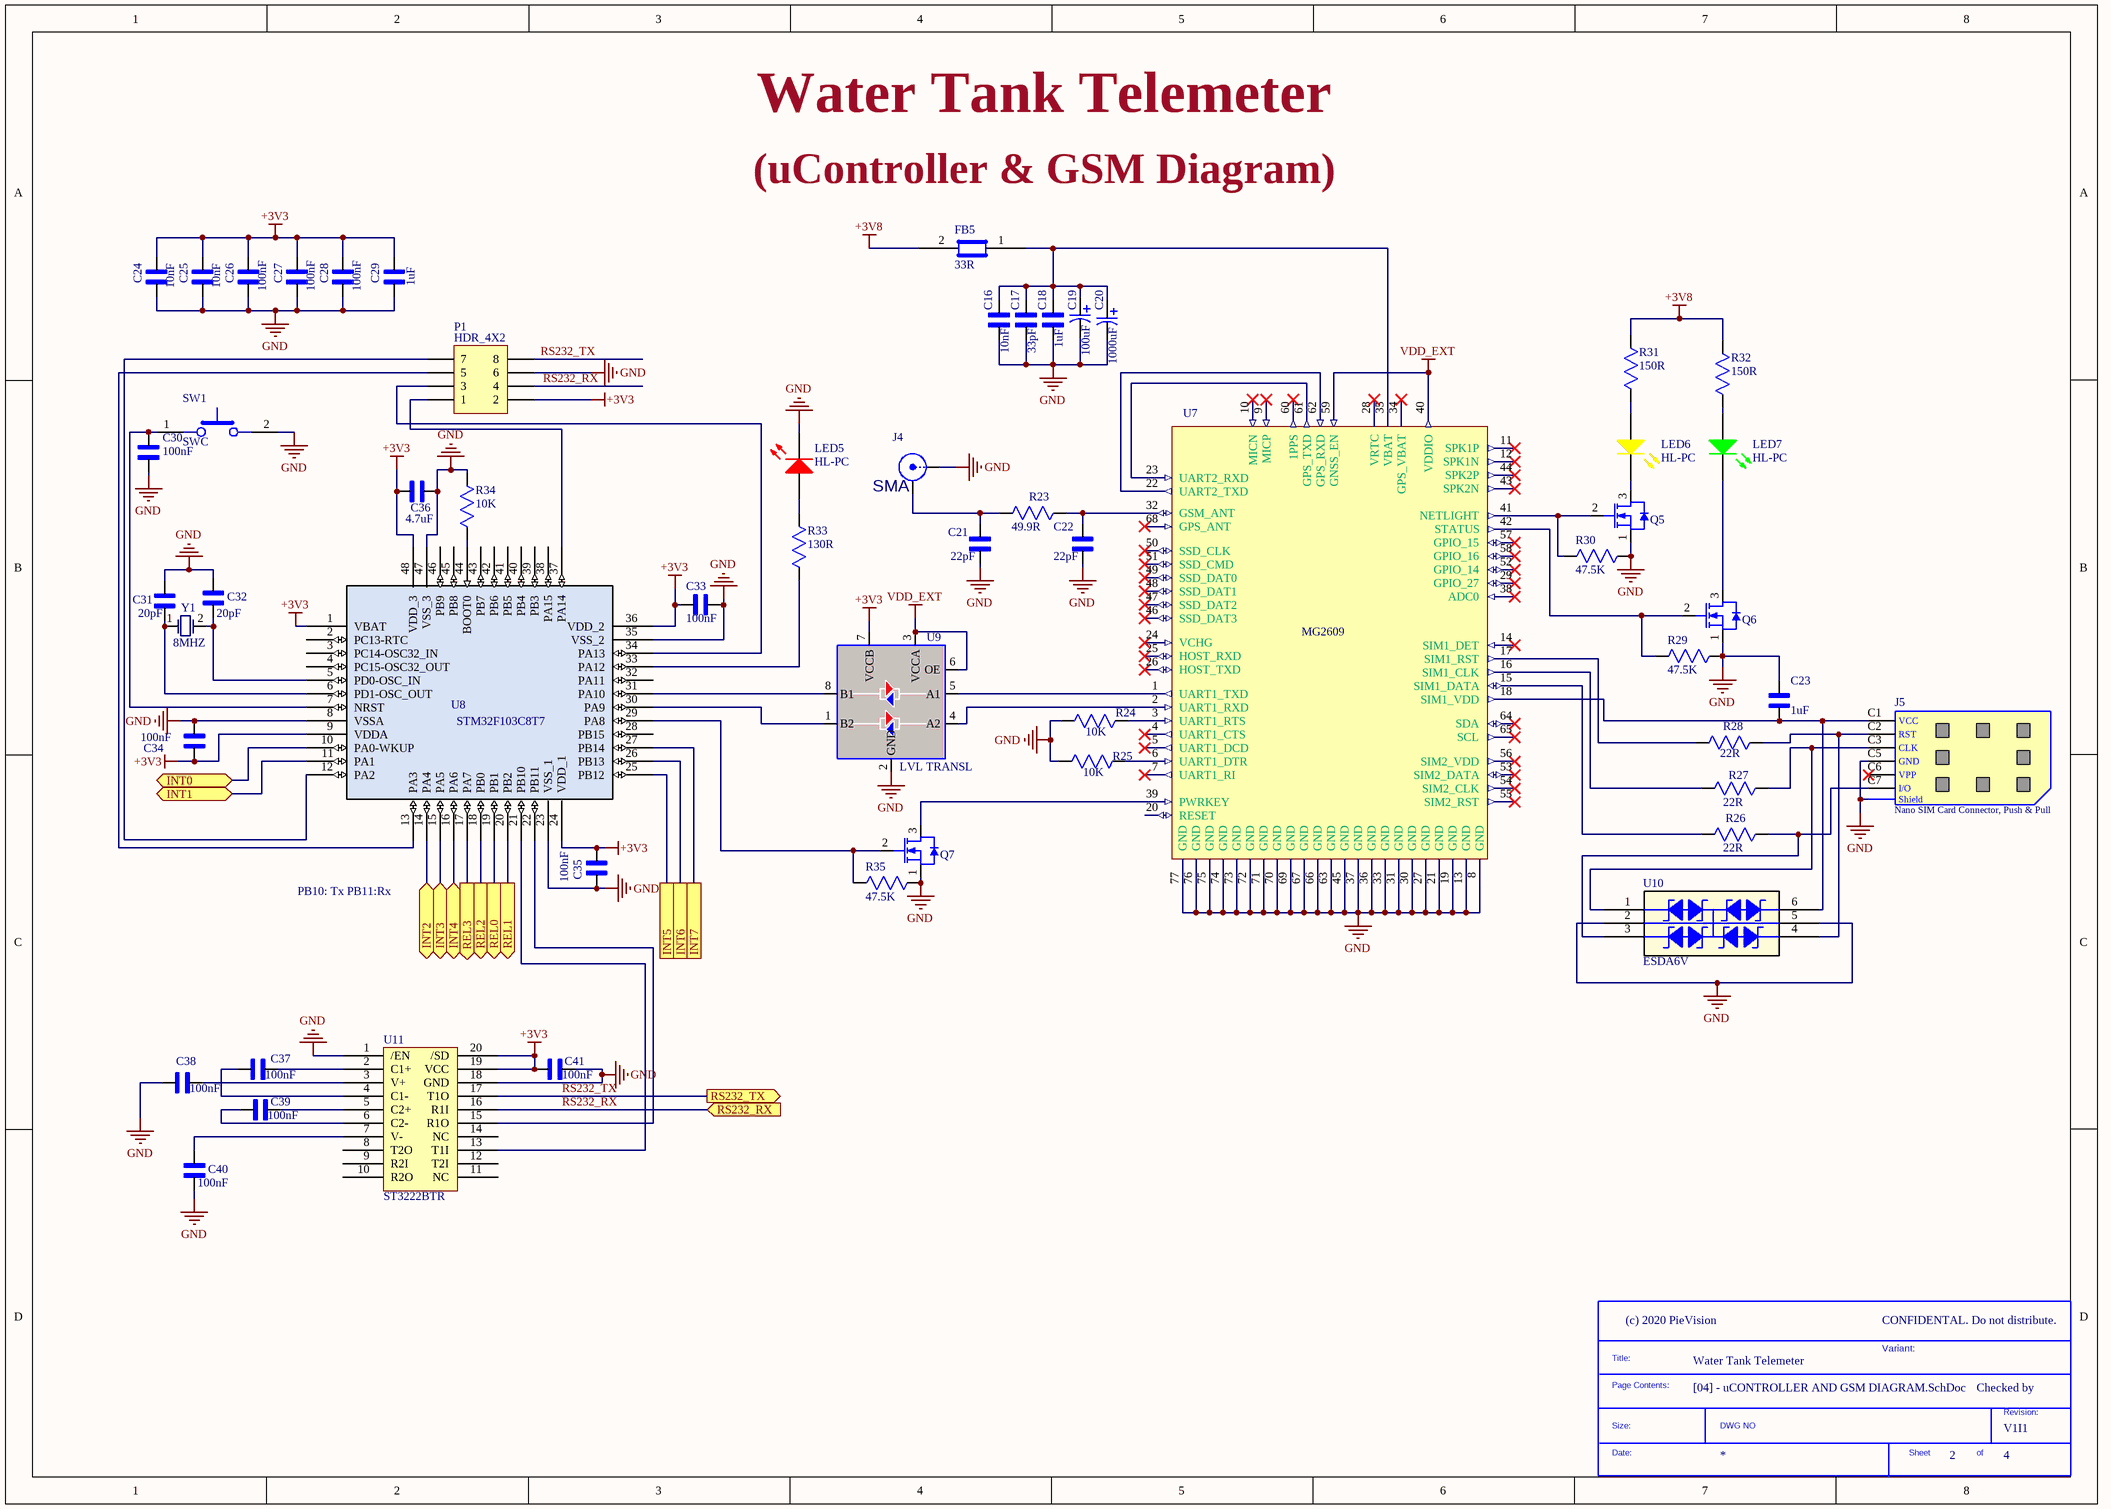
[diagram p4: [04] - uCONTROLLER AND GSM DIAGRAM.SchDoc]

### Parts
(Parts that share a designator on the sheet are numbered #1, #2 ... from top to bottom, then left to right.)
*#5  SDTitleBlock  (value not drawn)  (graphical)
C16  10nF  [CAP_0805]
C17  33pF  [CAP_0805]
C18  1uF  [CAP_0805]
C19  100uF  [CAP_TANT_CASEB]
C20  1000uF  [CAP_AL_0810]
C21  22pF  [CAP_0805]
C22  22pF  [CAP_0805]
C23  1uF  [CAP_0805]
C24  10nF  [CAP_0805]
C25  10nF  [CAP_0805]
C26  100nF  [CAP_0805]
C27  100nF  [CAP_0805]
C28  100nF  [CAP_0805]
C29  1uF  [CAP_0805]
C30  100nF  [CAP_0805]
C31  20pF  [CAP_0805]
C32  20pF  [CAP_0805]
C33  100nF  [CAP_0805]
C34  100nF  [CAP_0805]
C35  100nF  [CAP_0805]
C36  4.7uF  [CAP_0805]
C37  100nF  [CAP_0805]
C38  100nF  [CAP_0805]
C39  100nF  [CAP_0805]
C40  100nF  [CAP_0805]
C41  100nF  [CAP_0805]
FB5  33R  [FB_0603]
J4  SMA  [CONN_SMA_H]
J5  Nano SIM Card Connector, Push & Pull  [SOC_NSIM]
LED5  HL-PC  [LED_RED_1206]
LED6  HL-PC  [LED_YELLOW_1206]
LED7  HL-PC  [LED_GREEN_1206]
P1  HDR_4X2  [HDR2X4]
Q5  UTM2054G  [SOT-23]  (value not drawn)
Q6  UTM2054G  [SOT-23]  (value not drawn)
Q7  UTM2054G  [SOT-23]  (value not drawn)
R23  49.9R  [RES_0603]
R24  10K  [RES_0805]
R25  10K  [RES_0805]
R26  22R  [RES_0805]
R27  22R  [RES_0805]
R28  22R  [RES_0805]
R29  47.5K  [RES_0805]
R30  47.5K  [RES_0805]
R31  150R  [RES_0805]
R32  150R  [RES_0805]
R33  130R  [RES_0805]
R34  10K  [RES_0805]
R35  47.5K  [RES_0805]
SW1  SWC  [TAC_0603_VT]
U7  MG2609  [LCC_17P6X15P7X2P3]
U8  STM32F103C8T7  [LQFP-48]
U9  LVL TRANSL  [VSSOP8]
U10  ESDA6V  [SOT23-6L]
U11  ST3222BTR  [TSSOP20]
Y1  8MHZ  [CRYS_THT]

### Ports
INT0 (bidir), INT1 (bidir), INT2 (bidir), INT3 (bidir), INT4 (bidir), INT5, INT6, INT7, REL0 (out), REL1 (out), REL2 (out), REL3 (out), RS232_RX (in), RS232_TX (out)

### Nets
+3V3: C24.2 C25.2 C26.2 C27.2 C28.2 C29.2 C33.1 C34.2 C35.1 C36.1 C41.1 P1.2 U8.1(VBAT) U8.9(VDDA) U8.24(VDD_1) U8.36(VDD_2) U8.48(VDD_3) U9.7(VCCB) U11.19(VCC) U11.20(/SD)
+3V8: FB5.2 R31.1 R32.1
GND: C16.1 C17.1 C18.1 C19.2 C20.2 C21.1 C22.1 C23.2 C24.1 C25.1 C26.1 C27.1 C28.1 C29.1 C30.2 C31.2 C32.2 C33.2 C34.1 C35.2 C36.2 C38.1 C40.1 C41.2 J4.2 J5.C5(GND) J5.Shield LED5.1(K) P1.6 Q5.1(S) Q6.1(S) Q7.1(S) R24.2 R25.2 R29.1 R30.1 R34.1 R35.1 SW1.2 U7.8(GND) U7.13(GND) U7.19(GND) U7.21(GND) U7.27(GND) U7.30(GND) U7.31(GND) U7.33(GND) U7.36(GND) U7.37(GND) U7.45(GND) U7.63(GND) U7.66(GND) U7.67(GND) U7.69(GND) U7.70(GND) U7.71(GND) U7.72(GND) U7.73(GND) U7.74(GND) U7.75(GND) U7.76(GND) U7.77(GND) U8.8(VSSA) U8.23(VSS_1) U8.35(VSS_2) U8.47(VSS_3) U9.2(GND) U10.2 U10.5 U11.1(/EN) U11.18(GND)
VDD_EXT: U7.40(VDDIO) U7.59(GNSS_EN) U9.3(VCCA) U9.6(OE)
RS232_RX: P1.4 U11.16(R1I) ; port RS232_RX
RS232_TX: P1.8 U11.17(T1O) ; port RS232_TX
NetC16_2: C16.2 C17.2 C18.2 C19.1 C20.1 FB5.1 U7.35(VBAT)
NetC21_2: C21.2 J4.1 R23.2
NetC22_2: C22.2 R23.1 U7.32(GSM_ANT)
NetC23_1: C23.1 J5.C1(VCC) U7.18(SIM1_VDD) U10.6
NetC30_1: C30.1 SW1.1 U8.7(NRST)
NetC31_1: C31.1 U8.6(PD1-OSC_OUT) Y1.1
NetC32_1: C32.1 U8.5(PD0-OSC_IN) Y1.2
NetC37_1: C37.1 U11.4(C1-)
NetC37_2: C37.2 U11.2(C1+)
NetC38_2: C38.2 U11.3(V+)
NetC39_1: C39.1 U11.6(C2-)
NetC39_2: C39.2 U11.5(C2+)
NetC40_2: C40.2 U11.7(V-)
NetJ5_C2: J5.C2(RST) R28.1 U10.4
NetJ5_C3: J5.C3(CLK) R27.1 U10.1
NetJ5_C7: J5.C7(I/O) R26.1 U10.3
NetLED5_2: LED5.2(A) R33.1
NetLED6_1: LED6.1(K) Q5.3(D)
NetLED6_2: LED6.2(A) R31.2
NetLED7_1: LED7.1(K) Q6.3(D)
NetLED7_2: LED7.2(A) R32.2
NetP1_1: P1.1 U8.37(PA14)
NetP1_3: P1.3 U8.34(PA13)
NetP1_5: P1.5 U8.13(PA3)
NetP1_7: P1.7 U8.12(PA2)
NetQ5_2: Q5.2(G) R30.2 U7.41(NETLIGHT)
NetQ6_2: Q6.2(G) R29.2 U7.42(STATUS)
NetQ7_2: Q7.2(G) R35.2 U8.29(PA8)
NetQ7_3: Q7.3(D) U7.39(PWRKEY)
NetQ9_2: U8.19(PB1) ; port REL0
NetQ10_2: U8.20(PB2) ; port REL1
NetQ11_2: U8.18(PB0) ; port REL2
NetQ12_2: U8.17(PA7) ; port REL3
NetR24_1: R24.1 U7.3(UART1_RTS)
NetR25_1: R25.1 U7.6(UART1_DTR)
NetR26_2: R26.2 U7.15(SIM1_DATA)
NetR27_2: R27.2 U7.16(SIM1_CLK)
NetR28_2: R28.2 U7.17(SIM1_RST)
NetR33_2: R33.2 U8.33(PA12)
NetR34_2: R34.2 U8.44(BOOT0)
NetR45_1: U8.10(PA0-WKUP) ; port INT0
NetR46_1: U8.11(PA1) ; port INT1
NetR47_1: U8.14(PA4) ; port INT2
NetR48_2: U8.15(PA5) ; port INT3
NetR49_2: U8.16(PA6) ; port INT4
NetR50_1: U8.25(PB12) ; port INT5
NetR51_1: U8.26(PB13) ; port INT6
NetR52_1: U8.27(PB14) ; port INT7
NetU7_1: U7.1(UART1_TXD) U9.5(A1)
NetU7_2: U7.2(UART1_RXD) U9.4(A2)
NetU7_22: U7.22(UART2_TXD) U7.62(GPS_RXD)
NetU7_23: U7.23(UART2_RXD) U7.61(GPS_TXD)
NetU8_21: U8.21(PB10) U11.13(T1I)
NetU8_22: U8.22(PB11) U11.15(R1O)
NetU8_30: U8.30(PA9) U9.1(B2)
NetU8_31: U8.31(PA10) U9.8(B1)

Not connected (* = marked no-connect by the designer): J5 C6(VPP)*; U7 4(UART1_CTS)* 5(UART1_DCD)* 7(UART1_RI)* 9(MICP)* 10(MICN)* 11(SPK1P)* 12(SPK1N)* 14(SIM1_DET)* 20(RESET) 24(VCHG)* 25(HOST_RXD)* 26(HOST_TXD)* 28(VRTC)* 29(GPIO_27)* 34(GPS_VBAT)* 38(ADC0)* 43(SPK2N)* 44(SPK2P)* 46(SSD_DAT3)* 47(SSD_DAT2)* 48(SSD_DAT1)* 49(SSD_DAT0)* 50(SSD_CLK)* 51(SSD_CMD)* 52(GPIO_14)* 53(SIM2_DATA)* 54(SIM2_CLK)* 55(SIM2_RST)* 56(SIM2_VDD)* 57(GPIO_15)* 58(GPIO_16)* 60(1PPS)* 64(SDA)* 65(SCL)* 68(GPS_ANT)*; U8 2(PC13-RTC) 3(PC14-OSC32_IN) 4(PC15-OSC32_OUT) 28(PB15) 32(PA11) 38(PA15) 39(PB3) 40(PB4) 41(PB5) 42(PB6) 43(PB7) 45(PB8) 46(PB9); U11 8(T2O) 9(R2I) 10(R2O) 11(NC) 12(T2I) 14(NC)

### Notes on the sheet
- (uController & GSM Diagram)
- PB10: Tx PB11:Rx
- CONFIDENTAL. Do not distribute.
- Variant:
- Checked by
- (in symbol SDTitleBlock) Title:; Page Contents:; Revision:; Size:; DWG NO; Date:; Sheet; of

### Library data of the parts
C16 C24 C25 = CAP_0805: as C3 on sheet [03] - POWER DIAGRAM; Package: 0805; Value: 10nF; .Checked SCH: CHK
C17 = CAP_0805: Product Name: CL21C330GBANNNC; Product Description: MLCC (2012) 0805 33pF 50VDC ±2% C0G (NP0); .Checked PCB: CHK; Package: 0805; Value: 33pF; .Checked SCH: CHK
C18 C23 C29 = CAP_0805: as C6 on sheet [03] - POWER DIAGRAM; Package: 0805; Value: 1uF; .Checked SCH: CHK
C19 = CAP_TANT_CASEB: =Product Descriptipn; Product Name: T491B107K006AT; Product Description: CAP.TANTAL 100uF 6.3V 10% B CASE (3528) SMD KEMET; .Checked PCB: CHK; Value: 100uF; Case Dimension (mm) LxWxH: B CASE; .Checked SCH: CHK
C20 = CAP_AL_0810: =Product Description; Manufacturer: SAMYOUNG; Product Name: BXJ6.3VC1000MH10TP; Product Description: CAP.EL.1000uF 6V3 8x10 105C 5000Hrs SMD; .Checked PCB: CHK; Value: 1000uF; .Checked SCH: CHK
C21 C22 = CAP_0805: Product Name: CL21C220JBANNNC; Product Description: MLCC (2012) 0805 22pF 50VDC ±5% C0G (NP0); .Checked PCB: CHK; Package: 0805; Value: 22pF; .Checked SCH: CHK
C26-C28 C30 C33-C35 C37-C41 = CAP_0805: as C9 on sheet [03] - POWER DIAGRAM; Package: 0805; Value: 100nF; .Checked SCH: CHK
C31 C32 = CAP_0805: Product Name: CL21C200JBANNNC; Product Description: MLCC (2012) 0805 20pF 50VDC ±5% C0G (NP0); .Checked PCB: CHK; Package: 0805; Value: 20pF; .Checked SCH: CHK
C36 = CAP_0805: MLCC (2012) 0805 4.7uF 25VDC ±10% X5R; Product Name: CL21A475KAQNNNE; .Checked PCB: CHK; Package: 0805; Product Description: MLCC (2012) 0805 4.7uF 25VDC ±10% X5R; Value: 4.7uF; .Checked SCH: CHK
FB5 = FB_0603: as FB1 on sheet [03] - POWER DIAGRAM; Value: 33R; Package / Case: 0603; .Checked SCH: CHK
J4 = SMA_RA: =Product Description; Product Name: L-KLS1-SMA045; Product Description: CONNECTOR SMA 5PIN THT R/A 8x8x14.8MM; .Checked PCB: CHK; Mounting Type: THT R/A; .Checked SCH: CHK; Value: SMA
J5 = SOC_NSIM: =Product Description; Manufacturer: ATTEND; Product Name: 115U-A000; Product Description: CONNECTOR NANO SIM CARD PUSH PULL 6PIN H:1.2MM; Number of Position: 6; Eject Mechanism: PUSH-PULL; .Checked PCB: CHK; .Checked SCH: CHK
LED5 = LED_RED_1206: as LED1 on sheet [03] - POWER DIAGRAM; Value: HL-PC; .Checked SCH: CHK
LED6 = LED_YELLOW_1206: =Product Description; Manufacturer: HONGLITRONIC; Product Description: LED SMD 1206 YELLOW WATER CLEAR 90-120mcd 140C; Product Name: HL-PC-3216S29YC; Color: YELLOW; .Checked PCB: CHK; Value: HL-PC; .Checked SCH: CHK
LED7 = LED_GREEN_1206: as LED4 on sheet [03] - POWER DIAGRAM; Value: HL-PC; .Checked SCH: CHK
P1 = HDR_4X2: =Product Description; Product Description: Header, 4-Pin, Dual row; .Checked PCB: CHK; LatestRevisionDate: 17-Jul-2002; LatestRevisionNote: Re-released for DXP Platform.; Publisher: Altium Limited; .Checked SCH: CHK
Q5-Q7 = MOSFET_N_SOT23: =Product Description; Manufacturer: UTC; Product Name: UTM2054G-AE3-R; Product Description: MOSFET DIS.5A 20V N-CH SOT23 ENHANCEMENT SMT; .Checked PCB: CHK; Package / Case: SOT23; Value: UTM2054G; .Checked SCH: CHK
R23 = RES_0603: =Product Description; Product Name: TC0325D499JT5C; Product Description: RES.(1608) 0603 49.9 Ohms 0.5% 1/16W 25PPM; Tolerance: ±0.5%; Watt: 1/16W; .Checked PCB: CHK; Package / Case: 0603; Value: 49.9R; .Checked SCH: CHK
R24 R25 R34 = RES_0805: =Product Description; Product Name: 0805S8J0103T5E; Package2: 0805; Product Description: RES.(2012) 0805 10K Ohms 5% 1/8W-S 100PPM; .Checked PCB: CHK; Value: 10K; .Checked SCH: CHK
R26-R28 = RES_0805: =Product Description; Product Name: CQ05S8F220JT5E; Package2: 0805; Product Description: RES.(2012) 0805 22 Ohms 1% 1/8W-S AUTOMOTIV; .Checked PCB: CHK; Value: 22R; .Checked SCH: CHK
R29 R30 R35 = RES_0805: =Product Description; Product Name: 0805S8F4752T5E; Package2: 0805; Product Description: RES.(2012) 0805 47.5K Ohms 1% 1/8W-S 100PPM; .Checked PCB: CHK; Value: 47.5K; .Checked SCH: CHK
R31 R32 = RES_0805: =Product Description; Product Name: 0805S8J0151T5E; Package2: 0805; Product Description: RES.(2012) 0805 150 Ohms 5% 1/8W-S 100PPM; .Checked PCB: CHK; Value: 150R; .Checked SCH: CHK
R33 = RES_0805: =Product Description; Product Name: 0805S8J0131T5E; Package2: 0805; Product Description: RES.(2012) 0805 130 Ohms 5% 1/8W-S 100PPM; .Checked PCB: CHK; Value: 130R; .Checked SCH: CHK
SW1 = TACT_SMD_VT_6MM: =Product Description; .Checked PCB: CHK; Product Name: DTSMF-31R-V-T/R; Product Description: SWITCH TACT 6x3.5MM 4.3MM 260gf SMD DIPTRONICS; .Checked SCH: CHK; Outline: SWC; Value: SWC
U7 = MG2609: Product Description; Manufacturer: GOSUNCN; Product Name: HZ-MG2609-C1B-MK-01; Product Description: MODULE GSM/GPRS + ( OPTIONAL )GNSS; .Checked PCB: CHK; Package / Case: LCC (17.6 x 15.7 x 2.3); Value: MG2609; .Checked SCH: CHK
U8 = STM32F103C8T7: IC-32F103C MCU 32BIT 64KB FLASH 48LQFP; Product Name: STM32F103C8T7TR; .Checked PCB: CHK; Link: https://www.ozdisan.com/integrated-circuits-ics/embedded-ics/microcontrollers/STM32F103C8T7TR; .Checked SCH: CHK
U9 = TXB0102DCUR: =Product Description; Manufacturer: TEXAS; Product Description: IC-102 VOLT-LVL TRANSL BI-DIR US8; .Checked SCH: CHK; Value: LVL TRANSL; Product Name: TXB0102DCUR; Package / Case: VSSOP8; .Checked PCB: CHK
U10 = TVS_SOT236: =Product Description; Manufacturer: STM; Product Name: ESDA6V1BC6; Product Description: DIODE TVS 80W 5V SOT23 SMD; .Checked PCB: CHK; Package / Case: SOT23-6; .Checked SCH: CHK
U11 = TRANS_RS232: =Product Description; Product Description: IC-3222 DRIVER/RCVR RS232 LP 20-TSSOP; .Checked PCB: CHK; Product Name: ST3222BTR; Package: TSSOP20; Value: ST3222BTR; .Checked SCH: CHK
Y1 = CRYS-THT: =Product Description; Product Name: AS-8.000-20-H35; Product Description: CRYSTAL 8MHZ HC49S 20pF 30ppm SHORT BULK RALTRON; .Checked PCB: CHK; Value: 8MHZ; Package / Case: HC-49S; .Checked SCH: CHK

## Sheet [05] - PERIFERALS DIAGRAM.SchDoc
size A3; DocumentNumber: 2; SheetNumber: 2; SheetTotal: 4; .Checked PCB: .; .Checked SCH: .
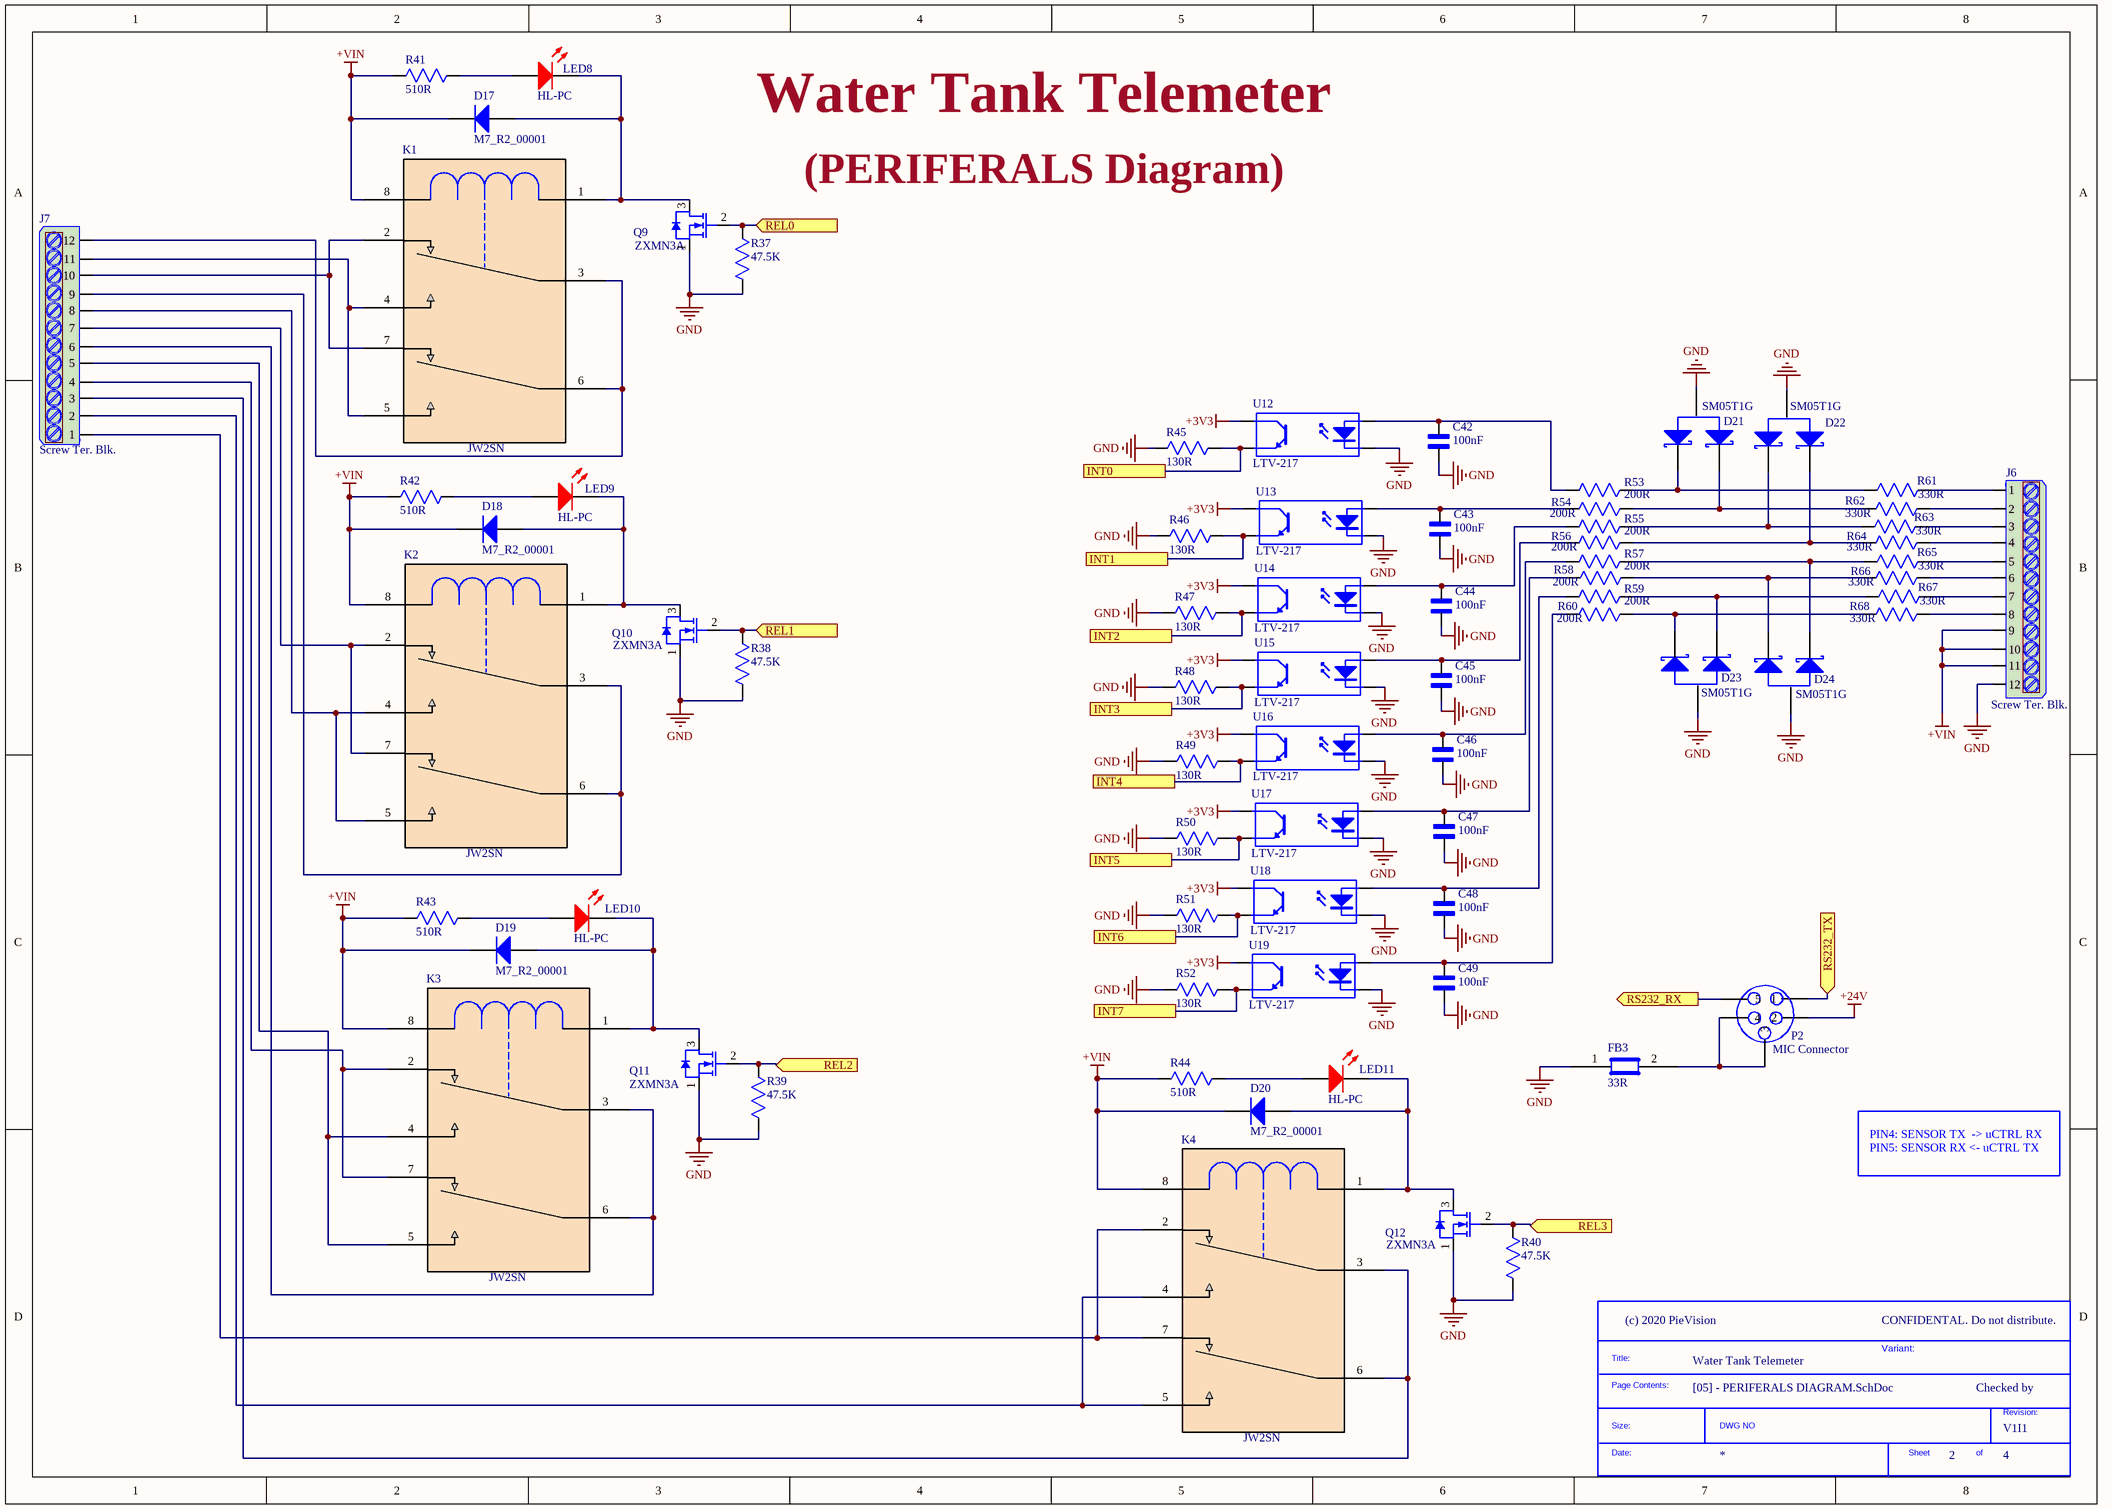
[diagram p5: [05] - PERIFERALS DIAGRAM.SchDoc]

### Parts
(Parts that share a designator on the sheet are numbered #1, #2 ... from top to bottom, then left to right.)
*#6  SDTitleBlock  (value not drawn)  (graphical)
C42  100nF  [CAP_0805]
C43  100nF  [CAP_0805]
C44  100nF  [CAP_0805]
C45  100nF  [CAP_0805]
C46  100nF  [CAP_0805]
C47  100nF  [CAP_0805]
C48  100nF  [CAP_0805]
C49  100nF  [CAP_0805]
D17  M7_R2_00001  [DID_SMA]
D18  M7_R2_00001  [DID_SMA]
D19  M7_R2_00001  [DID_SMA]
D20  M7_R2_00001  [DID_SMA]
D21  SM05T1G  [SOT-23]
D22  SM05T1G  [SOT-23]
D23  SM05T1G  [SOT-23]
D24  SM05T1G  [SOT-23]
FB3  33R  [FB_0603]
J6  Screw Ter. Blk.  [TERM_BLK_12P]
J7  Screw Ter. Blk.  [TERM_BLK_12P]
K1  JW2SN  [RELAY_DPDT]
K2  JW2SN  [RELAY_DPDT]
K3  JW2SN  [RELAY_DPDT]
K4  JW2SN  [RELAY_DPDT]
LED8  HL-PC  [LED_RED_1206]
LED9  HL-PC  [LED_RED_1206]
LED10  HL-PC  [LED_RED_1206]
LED11  HL-PC  [LED_RED_1206]
P2  MIC Connector  [CONN_MIC_5P]
Q9  ZXMN3A  [SOT-23]
Q10  ZXMN3A  [SOT-23]
Q11  ZXMN3A  [SOT-23]
Q12  ZXMN3A  [SOT-23]
R37  47.5K  [RES_0805]
R38  47.5K  [RES_0805]
R39  47.5K  [RES_0805]
R40  47.5K  [RES_0805]
R41  510R  [RES_1206]
R42  510R  [RES_1206]
R43  510R  [RES_1206]
R44  510R  [RES_1206]
R45  130R  [RES_0805]
R46  130R  [RES_0805]
R47  130R  [RES_0805]
R48  130R  [RES_0805]
R49  130R  [RES_0805]
R50  130R  [RES_0805]
R51  130R  [RES_0805]
R52  130R  [RES_0805]
R53  200R  [RES_1206]
R54  200R  [RES_1206]
R55  200R  [RES_1206]
R56  200R  [RES_1206]
R57  200R  [RES_1206]
R58  200R  [RES_1206]
R59  200R  [RES_1206]
R60  200R  [RES_1206]
R61  330R  [RES_1206]
R62  330R  [RES_1206]
R63  330R  [RES_1206]
R64  330R  [RES_1206]
R65  330R  [RES_1206]
R66  330R  [RES_1206]
R67  330R  [RES_1206]
R68  330R  [RES_1206]
U12  LTV-217  [SSOP-4]
U13  LTV-217  [SSOP-4]
U14  LTV-217  [SSOP-4]
U15  LTV-217  [SSOP-4]
U16  LTV-217  [SSOP-4]
U17  LTV-217  [SSOP-4]
U18  LTV-217  [SSOP-4]
U19  LTV-217  [SSOP-4]

### Ports
INT0, INT1, INT2, INT3, INT4, INT5, INT6, INT7, REL0 (in), REL1 (in), REL2 (in), REL3 (in), RS232_RX (out), RS232_TX (in)

### Nets
+3V3: U12.4(C) U13.4(C) U14.4(C) U15.4(C) U16.4(C) U17.4(C) U18.4(C) U19.4(C)
+24V: P2.2
+VIN: D17.2(K) D18.2(K) D19.2(K) D20.2(K) J6.9 J6.10 J6.11 K1.8 K2.8 K3.8 K4.8 R41.2 R42.2 R43.2 R44.2
GND: C42.2 C43.2 C44.2 C45.2 C46.2 C47.2 C48.2 C49.2 D21.3 D22.3 D23.3 D24.3 FB3.1 J6.12 Q9.1(S) Q10.1(S) Q11.1(S) Q12.1(S) R37.2 R38.2 R39.2 R40.2 R45.2 R46.2 R47.2 R48.1 R49.1 R50.2 R51.2 R52.2 U12.2(K) U13.2(K) U14.2(K) U15.2(K) U16.2(K) U17.2(K) U18.2(K) U19.2(K)
RS232_RX: P2.5 ; port RS232_RX
RS232_TX: P2.1 ; port RS232_TX
NetC42_1: C42.1 R53.2 U12.1(A)
NetC43_1: C43.1 R54.2 U13.1(A)
NetC44_1: C44.1 R55.2 U14.1(A)
NetC45_1: C45.1 R56.2 U15.1(A)
NetC46_1: C46.1 R57.2 U16.1(A)
NetC47_1: C47.1 R58.2 U17.1(A)
NetC48_1: C48.1 R59.2 U18.1(A)
NetC49_1: C49.1 R60.2 U19.1(A)
NetD17_1: D17.1(A) K1.1 LED8.1(K) Q9.3(D)
NetD18_1: D18.1(A) K2.1 LED9.1(K) Q10.3(D)
NetD19_1: D19.1(A) K3.1 LED10.1(K) Q11.3(D)
NetD20_1: D20.1(A) K4.1 LED11.1(K) Q12.3(D)
NetD21_1: D21.1 R53.1 R61.2
NetD21_2: D21.2 R54.1 R62.2
NetD22_1: D22.1 R55.1 R63.2
NetD22_2: D22.2 R56.1 R64.2
NetD23_1: D23.1 R59.1 R67.2
NetD23_2: D23.2 R60.1 R68.2
NetD24_1: D24.1 R57.1 R65.2
NetD24_2: D24.2 R58.1 R66.2
NetFB3_2: FB3.2 P2.3 P2.4
NetJ6_1: J6.1 R61.1
NetJ6_2: J6.2 R62.1
NetJ6_3: J6.3 R63.1
NetJ6_4: J6.4 R64.1
NetJ6_5: J6.5 R65.1
NetJ6_6: J6.6 R66.1
NetJ6_7: J6.7 R67.1
NetJ6_8: J6.8 R68.1
NetJ7_1: J7.1 K4.2 K4.7
NetJ7_2: J7.2 K4.4 K4.5
NetJ7_3: J7.3 K4.3 K4.6
NetJ7_4: J7.4 K3.2 K3.7
NetJ7_5: J7.5 K3.4 K3.5
NetJ7_6: J7.6 K3.3 K3.6
NetJ7_7: J7.7 K2.2 K2.7
NetJ7_8: J7.8 K2.4 K2.5
NetJ7_9: J7.9 K2.3 K2.6
NetJ7_10: J7.10 K1.2 K1.7
NetJ7_11: J7.11 K1.4 K1.5
NetJ7_12: J7.12 K1.3 K1.6
NetLED8_2: LED8.2(A) R41.1
NetLED9_2: LED9.2(A) R42.1
NetLED10_2: LED10.2(A) R43.1
NetLED11_2: LED11.2(A) R44.1
NetQ9_2: Q9.2(G) R37.1 ; port REL0
NetQ10_2: Q10.2(G) R38.1 ; port REL1
NetQ11_2: Q11.2(G) R39.1 ; port REL2
NetQ12_2: Q12.2(G) R40.1 ; port REL3
NetR45_1: R45.1 U12.3(E) ; port INT0
NetR46_1: R46.1 U13.3(E) ; port INT1
NetR47_1: R47.1 U14.3(E) ; port INT2
NetR48_2: R48.2 U15.3(E) ; port INT3
NetR49_2: R49.2 U16.3(E) ; port INT4
NetR50_1: R50.1 U17.3(E) ; port INT5
NetR51_1: R51.1 U18.3(E) ; port INT6
NetR52_1: R52.1 U19.3(E) ; port INT7

### Notes on the sheet
- (PERIFERALS Diagram)
- PIN4: SENSOR TX  -> uCTRL RX
  PIN5: SENSOR RX <- uCTRL TX
- CONFIDENTAL. Do not distribute.
- Variant:
- Checked by
- (in symbol SDTitleBlock) Title:; Page Contents:; Revision:; Size:; DWG NO; Date:; Sheet; of

### Library data of the parts
C42-C49 = CAP_0805: as C9 on sheet [03] - POWER DIAGRAM; Package: 0805; Value: 100nF; .Checked SCH: CHK
D17 = DID_SMA: =Product Description; Product Description: DIODE STAND. Single 1A 1000V SMT DO214AC (SMA); .Checked PCB: CHK; Product Name: M7_R2_00001; Package: SMA; Value: M7_R2_00001; .Checked SCH: CHK
D18-D20 = DID_SMA: =Product Description; Product Description: DIODE STAND. Single 1A 1000V SMT DO214AC (SMA); .Checked PCB: .; Product Name: M7_R2_00001; Package: SMA; Value: M7_R2_00001; .Checked SCH: .
D21-D24 = TVS_SOT23: =Product Description; Product Description: DIODE TVS 5VWM 9.8VC SOT23; .Checked PCB: CHK; Product Name: SM05T1G; Value: SM05T1G; Package: SOT23; .Checked SCH: CHK
FB3 = FB_0603: as FB1 on sheet [03] - POWER DIAGRAM; Value: 33R; Package / Case: 0603; .Checked SCH: CHK
J6 J7 = TERM_BLK_12POS: =Product Description; Product Name: GT301-5.0-12P-12-00AH; Product Description: TERM.BLK.5.00MM 12P PCB TYPE; .Checked PCB: CHK; ComponentLink1URL: https://www.molex.com/pdm_docs/sd/395321002_sd.pdf; ComponentLink1Description: https://www.molex.com/pdm_docs/sd/395321002_sd.pdf; Value: Screw Ter. Blk.; .Checked SCH: CHK
K1-K4 = REL_DPDT_12V: =Product Description; Product Name: JW2SN-DC12V; Product Description: RELAY POWER 5A 12VDC 2P PANASONIC; Contact Form: DPDT; .Checked PCB: CHK; Value: JW2SN; .Checked SCH: CHK
LED8 = LED_RED_1206: as LED1 on sheet [03] - POWER DIAGRAM; Value: HL-PC; .Checked SCH: CHK
LED9-LED11 = LED_RED_1206: as LED2 on sheet [03] - POWER DIAGRAM; Value: HL-PC; .Checked SCH: .
P2 = CONN_MIC_5P: =Product Description; ComponentLink1URL: https://www.molex.com/pdm_docs/sd/395321002_sd.pdf; ComponentLink1Description: https://www.molex.com/pdm_docs/sd/395321002_sd.pdf; Product Name: *; Product Description: *; Value: MIC Connector
Q9 Q10 = MOSFET_N_SOT23: =Product Description; Manufacturer: DIODES; Product Name: ZXMN3A01FTA; Product Description: MOSFET DIS.1.8A 30V N-CH SOT23 ENHANCEMENT SMT; .Checked PCB: .; Package / Case: SOT23; Value: ZXMN3A; .Checked SCH: .
Q11 Q12 = MOSFET_N_SOT23: =Product Description; Manufacturer: DIODES; Product Name: ZXMN3A01FTA; Product Description: MOSFET DIS.1.8A 30V N-CH SOT23 ENHANCEMENT SMT; .Checked PCB: CHK; Package / Case: SOT23; Value: ZXMN3A; .Checked SCH: CHK
R37 R38 = RES_0805: =Product Description; Product Name: 0805S8F4752T5E; Package2: 0805; Product Description: RES.(2012) 0805 47.5K Ohms 1% 1/8W-S 100PPM; .Checked PCB: .; Value: 47.5K; .Checked SCH: .
R39 R40 = RES_0805: as R29 on sheet [04] - uCONTROLLER AND GSM DIAGRAM; Value: 47.5K; .Checked SCH: CHK
R41 = RES_1206: =Product Description; Product Name: 1206S4J0511T5E; Product Description: RES.(3216) 1206 510 Ohms 5% 1/4W-S 100PPM; .Checked PCB: CHK; Package: 1206; Value: 510R; .Checked SCH: CHK
R42-R44 = RES_1206: =Product Description; Product Name: 1206S4J0511T5E; Product Description: RES.(3216) 1206 510 Ohms 5% 1/4W-S 100PPM; .Checked PCB: .; Package: 1206; Value: 510R; .Checked SCH: .
R45-R52 = RES_0805: =Product Description; Product Name: 0805S8J0131T5E; Product Description: RES.(2012) 0805 130 Ohms 5% 1/8W-S 100PPM; .Checked PCB: CHK; Package: 0805; Value: 130R; .Checked SCH: CHK
R53-R60 = RES_1206: =Product Description; Product Name: CQ06W4F2000T5E; Product Description: RES.(3216) 1206 200 Ohms 1% 1/4W-S AUTOMOTIV; .Checked PCB: CHK; Package: 1206; Value: 200R; .Checked SCH: CHK
R61-R68 = RES_1206: =Product Description; Product Name: CQ06W4F3300T5E; Product Description: RES.(3216) 1206 330 Ohms 1% 1/4W-S AUTOMOTIV; .Checked PCB: CHK; Package: 1206; Value: 330R; .Checked SCH: CHK
U12-U19 = OPTCOP: =Product Description; Manufacturer: LITEON; Product Name: LTV-217-B-G; Product Description: IC-217 OPTO. 3750V SSOP4; .Checked PCB: CHK; Package: SSOP4; Value: LTV-217; .Checked SCH: CHK

## Sheet [06] - REVISION HISTORY.SchDoc
size A3; DocumentNumber: 3; SheetNumber: 3; SheetTotal: 4
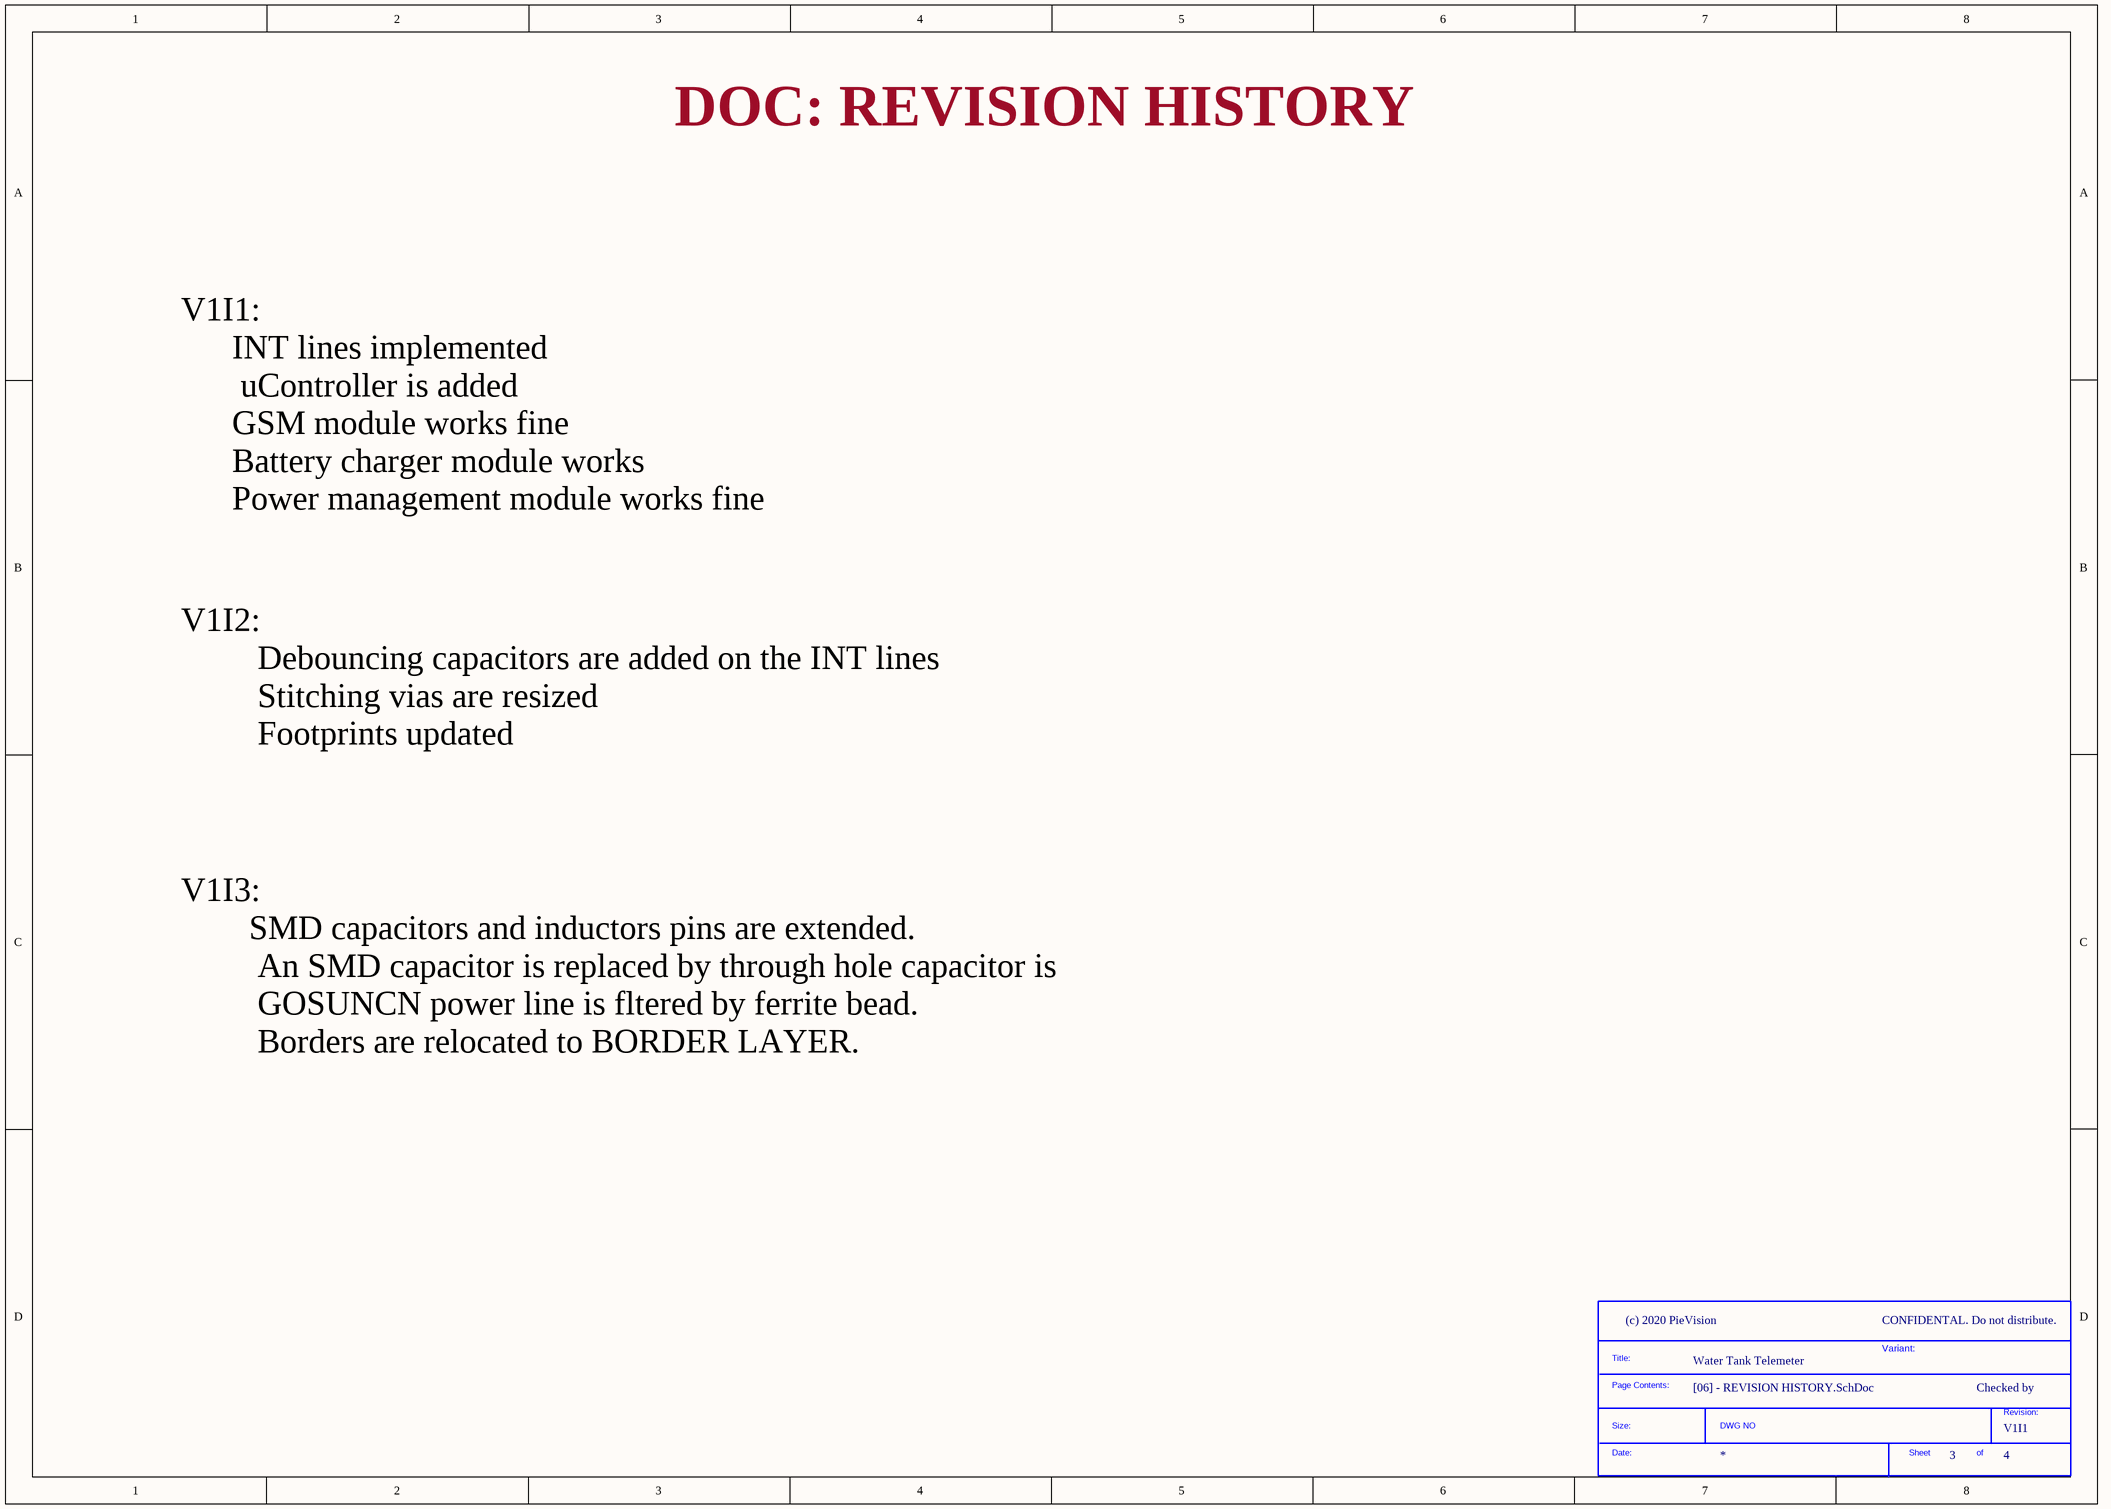
[diagram p6: [06] - REVISION HISTORY.SchDoc]

### Parts
(Parts that share a designator on the sheet are numbered #1, #2 ... from top to bottom, then left to right.)
*#7  SDTitleBlock  (value not drawn)  (graphical)

### Notes on the sheet
- DOC: REVISION HISTORY
- V1I1:
  INT lines implemented
  uController is added
  GSM module works fine
  Battery charger module works
  Power management module works fine
- V1I2:
  Debouncing capacitors are added on the INT lines
  Stitching vias are resized
  Footprints updated
- V1I3:
  SMD capacitors and inductors pins are extended.
  An SMD capacitor is replaced by through hole capacitor is
  GOSUNCN power line is fltered by ferrite bead.
  Borders are relocated to BORDER LAYER.
- CONFIDENTAL. Do not distribute.
- CLOCKS (CPU & PCIE)
- Variant:
- Checked by
- (in symbol SDTitleBlock) Title:; Page Contents:; Revision:; Size:; DWG NO; Date:; Sheet; of

## Nets that join several sheets
+3V3: [03] - POWER DIAGRAM (FB2.2 TP3.1), [04] - uCONTROLLER AND GSM DIAGRAM (20 pins), [05] - PERIFERALS DIAGRAM (8 pins)
+3V8: [03] - POWER DIAGRAM (C5.1 R5.1 TP2.1 U2.4), [04] - uCONTROLLER AND GSM DIAGRAM (FB5.2 R31.1 R32.1)
+24V: [03] - POWER DIAGRAM (5 pins), [05] - PERIFERALS DIAGRAM (P2.2)
+VIN: [03] - POWER DIAGRAM (8 pins), [05] - PERIFERALS DIAGRAM (15 pins)
GND: [03] - POWER DIAGRAM (36 pins), [04] - uCONTROLLER AND GSM DIAGRAM (71 pins), [05] - PERIFERALS DIAGRAM (38 pins)
NetQ9_2: [04] - uCONTROLLER AND GSM DIAGRAM (U8.19), [05] - PERIFERALS DIAGRAM (Q9.2 R37.1)
NetQ10_2: [04] - uCONTROLLER AND GSM DIAGRAM (U8.20), [05] - PERIFERALS DIAGRAM (Q10.2 R38.1)
NetQ11_2: [04] - uCONTROLLER AND GSM DIAGRAM (U8.18), [05] - PERIFERALS DIAGRAM (Q11.2 R39.1)
NetQ12_2: [04] - uCONTROLLER AND GSM DIAGRAM (U8.17), [05] - PERIFERALS DIAGRAM (Q12.2 R40.1)
NetR45_1: [04] - uCONTROLLER AND GSM DIAGRAM (U8.10), [05] - PERIFERALS DIAGRAM (R45.1 U12.3)
NetR46_1: [04] - uCONTROLLER AND GSM DIAGRAM (U8.11), [05] - PERIFERALS DIAGRAM (R46.1 U13.3)
NetR47_1: [04] - uCONTROLLER AND GSM DIAGRAM (U8.14), [05] - PERIFERALS DIAGRAM (R47.1 U14.3)
NetR48_2: [04] - uCONTROLLER AND GSM DIAGRAM (U8.15), [05] - PERIFERALS DIAGRAM (R48.2 U15.3)
NetR49_2: [04] - uCONTROLLER AND GSM DIAGRAM (U8.16), [05] - PERIFERALS DIAGRAM (R49.2 U16.3)
NetR50_1: [04] - uCONTROLLER AND GSM DIAGRAM (U8.25), [05] - PERIFERALS DIAGRAM (R50.1 U17.3)
NetR51_1: [04] - uCONTROLLER AND GSM DIAGRAM (U8.26), [05] - PERIFERALS DIAGRAM (R51.1 U18.3)
NetR52_1: [04] - uCONTROLLER AND GSM DIAGRAM (U8.27), [05] - PERIFERALS DIAGRAM (R52.1 U19.3)
RS232_RX: [04] - uCONTROLLER AND GSM DIAGRAM (P1.4 U11.16), [05] - PERIFERALS DIAGRAM (P2.5)
RS232_TX: [04] - uCONTROLLER AND GSM DIAGRAM (P1.8 U11.17), [05] - PERIFERALS DIAGRAM (P2.1)